# EAGLE design pid4_levitador (EAGLE 9.6.2)
Cuatro controladores PID analógicos (levitador magnético) - Brahiam Alberto Campiño Romero

## Sheet 1 of 4
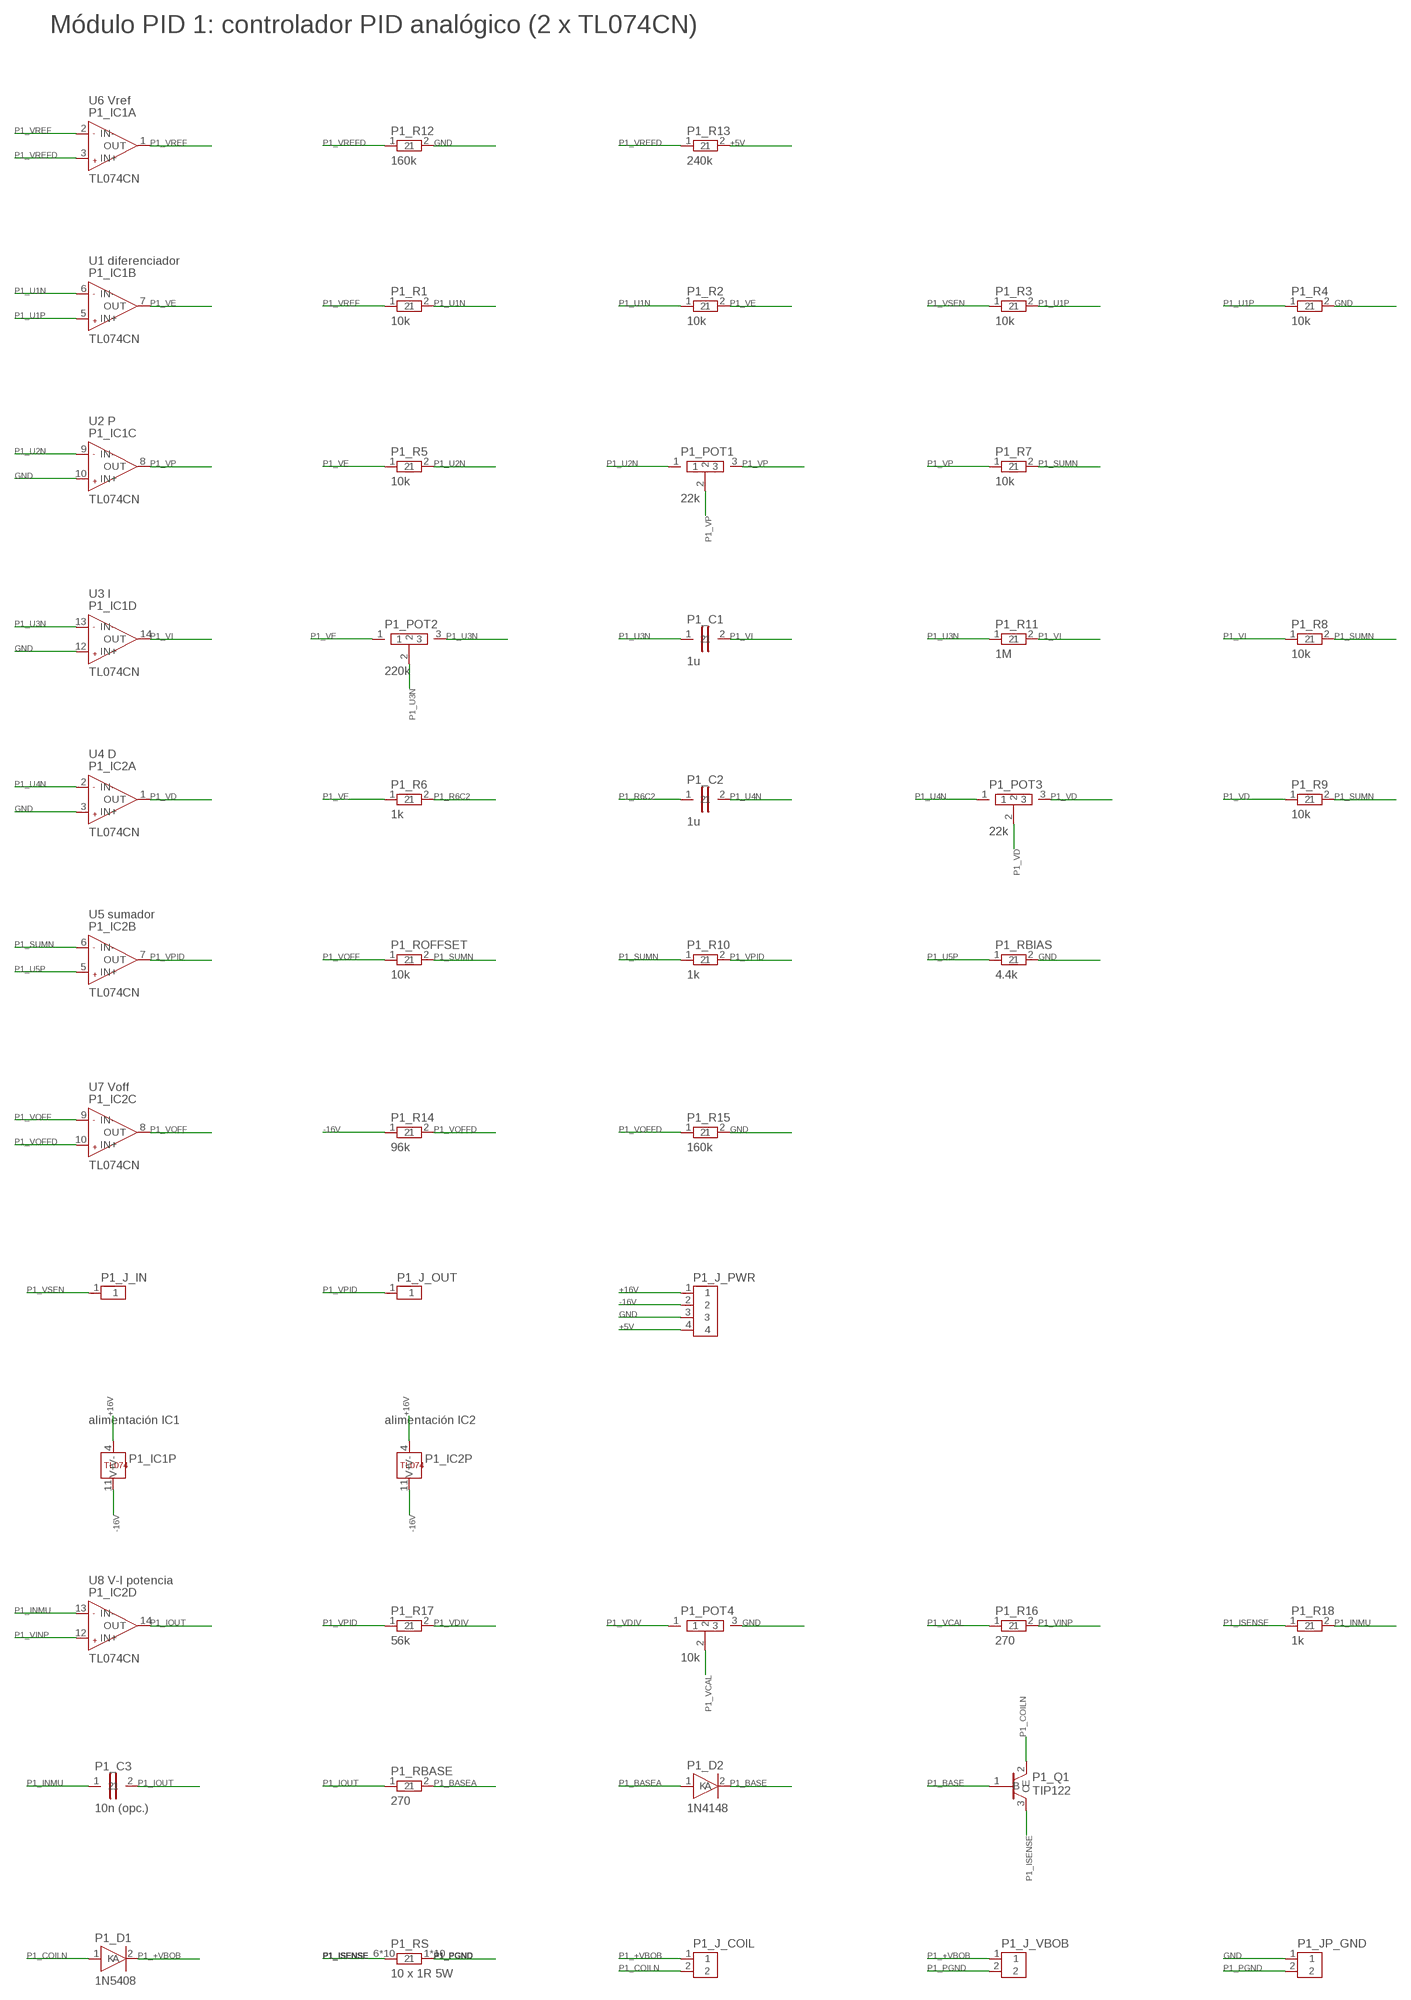
[diagram p0: schematic, sheet 1]

### Parts
P1_C1  1u  C  [CAP]
P1_C2  1u  C  [CAP]
P1_C3  10n (opc.)  C  [CAP]
P1_D1  1N5408  D1N5408  [DIODE]
P1_D2  1N4148  D1N4148  [DIODE_S]
P1_IC1  TL074CN  TL074  [DIL14]
P1_IC2  TL074CN  TL074  [DIL14]
P1_J_COIL  BOBINA  TERM2  [TERM2]
P1_J_IN  VSENSOR  HDR1  [HDR1]
P1_J_OUT  VPID  HDR1  [HDR1]
P1_J_PWR  PWR  HDR4  [HDR4]
P1_J_VBOB  VBOB  TERM2  [TERM2]
P1_JP_GND  GND-PGND  HDR2  [HDR2]
P1_POT1  22k  POT  [POT]
P1_POT2  220k  POT  [POT]
P1_POT3  22k  POT  [POT]
P1_POT4  10k  POT  [POT]
P1_Q1  TIP122  [TO220]
P1_R1  10k  R  [RES]
P1_R2  10k  R  [RES]
P1_R3  10k  R  [RES]
P1_R4  10k  R  [RES]
P1_R5  10k  R  [RES]
P1_R6  1k  R  [RES]
P1_R7  10k  R  [RES]
P1_R8  10k  R  [RES]
P1_R9  10k  R  [RES]
P1_R10  1k  R  [RES]
P1_R11  1M  R  [RES]
P1_R12  160k  R  [RES]
P1_R13  240k  R  [RES]
P1_R14  96k  R  [RES]
P1_R15  160k  R  [RES]
P1_R16  270  R  [RES]
P1_R17  56k  R  [RES]
P1_R18  1k  R  [RES]
P1_RBASE  270  R  [RES]
P1_RBIAS  4.4k  R  [RES]
P1_ROFFSET  10k  R  [RES]
P1_RS  10 x 1R 5W  RSB  [RSBANK]

### Nets
+5V: P1_J_PWR.4 P1_R13.2 ; also sheet 2,3,4
+16V: P1_IC1.4(P:V+) P1_IC2.4(P:V+) P1_J_PWR.1 ; also sheet 2,3,4
-16V: P1_IC1.11(P:V-) P1_IC2.11(P:V-) P1_J_PWR.2 P1_R14.1 ; also sheet 2,3,4
GND: P1_IC1.10(C:IN+) P1_IC1.12(D:IN+) P1_IC2.3(A:IN+) P1_J_PWR.3 P1_JP_GND.1 P1_POT4.3 P1_R4.2 P1_R12.2 P1_R15.2 P1_RBIAS.2 ; also sheet 2,3,4
P1_+VBOB: P1_D1.2(K) P1_J_COIL.1 P1_J_VBOB.1
P1_BASE: P1_D2.2(K) P1_Q1.1(B)
P1_BASEA: P1_D2.1(A) P1_RBASE.2
P1_COILN: P1_D1.1(A) P1_J_COIL.2 P1_Q1.2(C)
P1_INMU: P1_C3.1 P1_IC2.13(D:IN-) P1_R18.2
P1_IOUT: P1_C3.2 P1_IC2.14(D:OUT) P1_RBASE.1
P1_ISENSE: P1_Q1.3(E) P1_R18.1 P1_RS.6 P1_RS.7 P1_RS.8 P1_RS.9 P1_RS.10 P1_RS.11 P1_RS.12 P1_RS.13 P1_RS.14 P1_RS.15
P1_PGND: P1_J_VBOB.2 P1_JP_GND.2 P1_RS.1 P1_RS.2 P1_RS.3 P1_RS.4 P1_RS.5 P1_RS.16 P1_RS.17 P1_RS.18 P1_RS.19 P1_RS.20
P1_R6C2: P1_C2.1 P1_R6.2
P1_SUMN: P1_IC2.6(B:IN-) P1_R7.2 P1_R8.2 P1_R9.2 P1_R10.1 P1_ROFFSET.2
P1_U1N: P1_IC1.6(B:IN-) P1_R1.2 P1_R2.1
P1_U1P: P1_IC1.5(B:IN+) P1_R3.2 P1_R4.1
P1_U2N: P1_IC1.9(C:IN-) P1_POT1.1 P1_R5.2
P1_U3N: P1_C1.1 P1_IC1.13(D:IN-) P1_POT2.2 P1_POT2.3 P1_R11.1
P1_U4N: P1_C2.2 P1_IC2.2(A:IN-) P1_POT3.1
P1_U5P: P1_IC2.5(B:IN+) P1_RBIAS.1
P1_VCAL: P1_POT4.2 P1_R16.1
P1_VD: P1_IC2.1(A:OUT) P1_POT3.2 P1_POT3.3 P1_R9.1
P1_VDIV: P1_POT4.1 P1_R17.2
P1_VE: P1_IC1.7(B:OUT) P1_POT2.1 P1_R2.2 P1_R5.1 P1_R6.1
P1_VI: P1_C1.2 P1_IC1.14(D:OUT) P1_R8.1 P1_R11.2
P1_VINP: P1_IC2.12(D:IN+) P1_R16.2
P1_VOFF: P1_IC2.8(C:OUT) P1_IC2.9(C:IN-) P1_ROFFSET.1
P1_VOFFD: P1_IC2.10(C:IN+) P1_R14.2 P1_R15.1
P1_VP: P1_IC1.8(C:OUT) P1_POT1.2 P1_POT1.3 P1_R7.1
P1_VPID: P1_IC2.7(B:OUT) P1_J_OUT.1 P1_R10.2 P1_R17.1
P1_VREF: P1_IC1.1(A:OUT) P1_IC1.2(A:IN-) P1_R1.1
P1_VREFD: P1_IC1.3(A:IN+) P1_R12.1 P1_R13.1
P1_VSEN: P1_J_IN.1 P1_R3.1

### Notes on the sheet
- Módulo PID 1: controlador PID analógico (2 x TL074CN)
- U6 Vref
- U1 diferenciador
- U2 P
- U3 I
- U4 D
- U5 sumador
- U7 Voff
- alimentación IC1 | alimentación IC2
- U8 V-I potencia

## Sheet 2 of 4
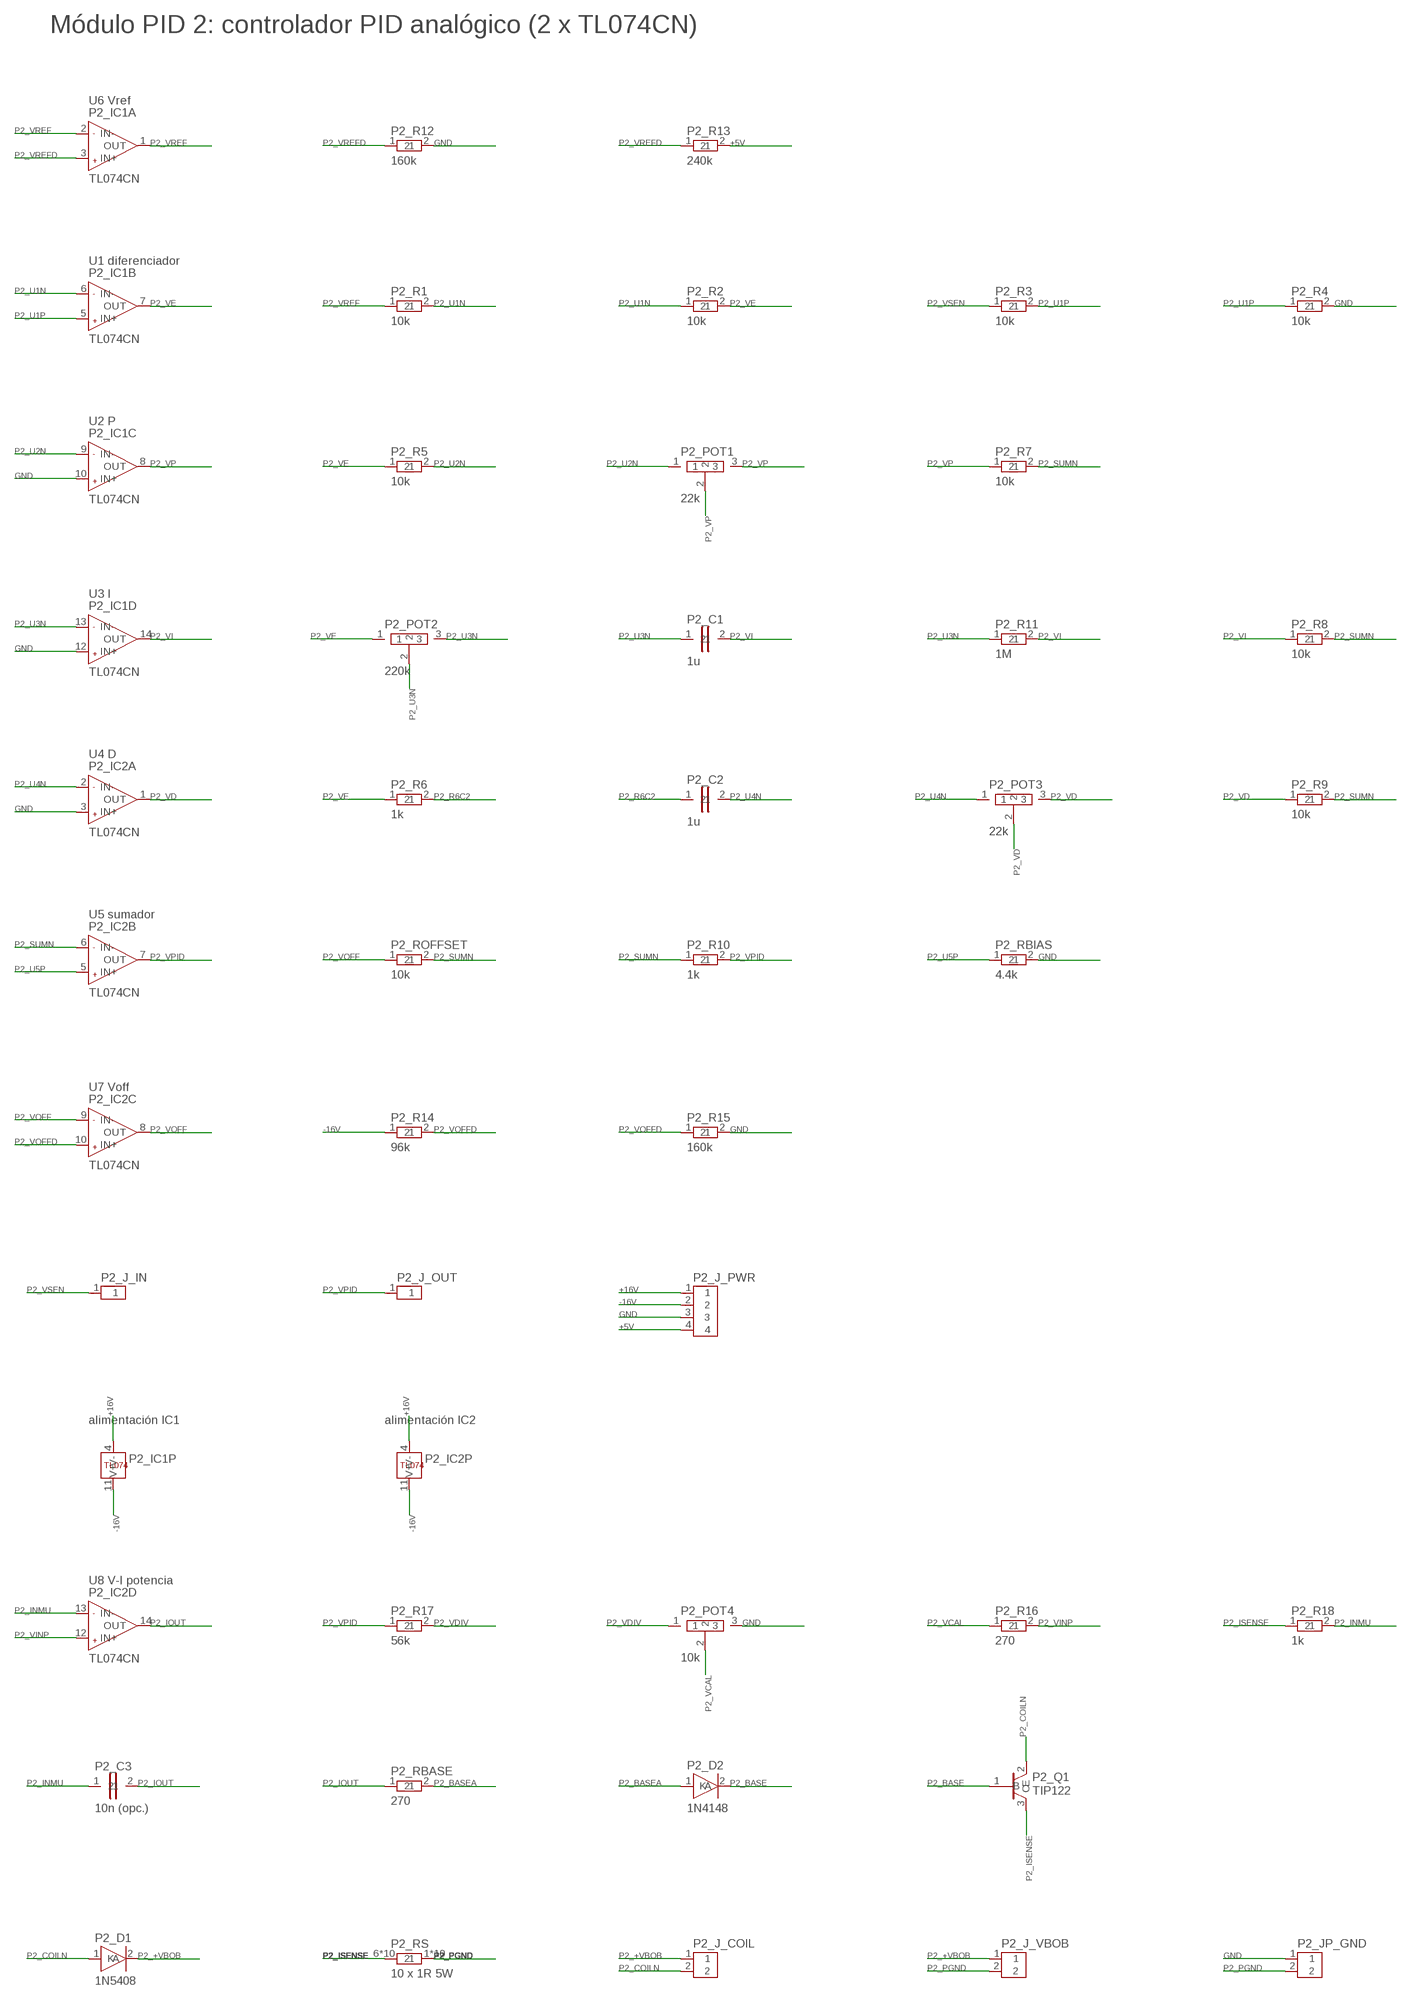
[diagram p1: schematic, sheet 2]

### Parts
P2_C1  1u  C  [CAP]
P2_C2  1u  C  [CAP]
P2_C3  10n (opc.)  C  [CAP]
P2_D1  1N5408  D1N5408  [DIODE]
P2_D2  1N4148  D1N4148  [DIODE_S]
P2_IC1  TL074CN  TL074  [DIL14]
P2_IC2  TL074CN  TL074  [DIL14]
P2_J_COIL  BOBINA  TERM2  [TERM2]
P2_J_IN  VSENSOR  HDR1  [HDR1]
P2_J_OUT  VPID  HDR1  [HDR1]
P2_J_PWR  PWR  HDR4  [HDR4]
P2_J_VBOB  VBOB  TERM2  [TERM2]
P2_JP_GND  GND-PGND  HDR2  [HDR2]
P2_POT1  22k  POT  [POT]
P2_POT2  220k  POT  [POT]
P2_POT3  22k  POT  [POT]
P2_POT4  10k  POT  [POT]
P2_Q1  TIP122  [TO220]
P2_R1  10k  R  [RES]
P2_R2  10k  R  [RES]
P2_R3  10k  R  [RES]
P2_R4  10k  R  [RES]
P2_R5  10k  R  [RES]
P2_R6  1k  R  [RES]
P2_R7  10k  R  [RES]
P2_R8  10k  R  [RES]
P2_R9  10k  R  [RES]
P2_R10  1k  R  [RES]
P2_R11  1M  R  [RES]
P2_R12  160k  R  [RES]
P2_R13  240k  R  [RES]
P2_R14  96k  R  [RES]
P2_R15  160k  R  [RES]
P2_R16  270  R  [RES]
P2_R17  56k  R  [RES]
P2_R18  1k  R  [RES]
P2_RBASE  270  R  [RES]
P2_RBIAS  4.4k  R  [RES]
P2_ROFFSET  10k  R  [RES]
P2_RS  10 x 1R 5W  RSB  [RSBANK]

### Nets
+5V: P2_J_PWR.4 P2_R13.2 ; also sheet 1,3,4
+16V: P2_IC1.4(P:V+) P2_IC2.4(P:V+) P2_J_PWR.1 ; also sheet 1,3,4
-16V: P2_IC1.11(P:V-) P2_IC2.11(P:V-) P2_J_PWR.2 P2_R14.1 ; also sheet 1,3,4
GND: P2_IC1.10(C:IN+) P2_IC1.12(D:IN+) P2_IC2.3(A:IN+) P2_J_PWR.3 P2_JP_GND.1 P2_POT4.3 P2_R4.2 P2_R12.2 P2_R15.2 P2_RBIAS.2 ; also sheet 1,3,4
P2_+VBOB: P2_D1.2(K) P2_J_COIL.1 P2_J_VBOB.1
P2_BASE: P2_D2.2(K) P2_Q1.1(B)
P2_BASEA: P2_D2.1(A) P2_RBASE.2
P2_COILN: P2_D1.1(A) P2_J_COIL.2 P2_Q1.2(C)
P2_INMU: P2_C3.1 P2_IC2.13(D:IN-) P2_R18.2
P2_IOUT: P2_C3.2 P2_IC2.14(D:OUT) P2_RBASE.1
P2_ISENSE: P2_Q1.3(E) P2_R18.1 P2_RS.6 P2_RS.7 P2_RS.8 P2_RS.9 P2_RS.10 P2_RS.11 P2_RS.12 P2_RS.13 P2_RS.14 P2_RS.15
P2_PGND: P2_J_VBOB.2 P2_JP_GND.2 P2_RS.1 P2_RS.2 P2_RS.3 P2_RS.4 P2_RS.5 P2_RS.16 P2_RS.17 P2_RS.18 P2_RS.19 P2_RS.20
P2_R6C2: P2_C2.1 P2_R6.2
P2_SUMN: P2_IC2.6(B:IN-) P2_R7.2 P2_R8.2 P2_R9.2 P2_R10.1 P2_ROFFSET.2
P2_U1N: P2_IC1.6(B:IN-) P2_R1.2 P2_R2.1
P2_U1P: P2_IC1.5(B:IN+) P2_R3.2 P2_R4.1
P2_U2N: P2_IC1.9(C:IN-) P2_POT1.1 P2_R5.2
P2_U3N: P2_C1.1 P2_IC1.13(D:IN-) P2_POT2.2 P2_POT2.3 P2_R11.1
P2_U4N: P2_C2.2 P2_IC2.2(A:IN-) P2_POT3.1
P2_U5P: P2_IC2.5(B:IN+) P2_RBIAS.1
P2_VCAL: P2_POT4.2 P2_R16.1
P2_VD: P2_IC2.1(A:OUT) P2_POT3.2 P2_POT3.3 P2_R9.1
P2_VDIV: P2_POT4.1 P2_R17.2
P2_VE: P2_IC1.7(B:OUT) P2_POT2.1 P2_R2.2 P2_R5.1 P2_R6.1
P2_VI: P2_C1.2 P2_IC1.14(D:OUT) P2_R8.1 P2_R11.2
P2_VINP: P2_IC2.12(D:IN+) P2_R16.2
P2_VOFF: P2_IC2.8(C:OUT) P2_IC2.9(C:IN-) P2_ROFFSET.1
P2_VOFFD: P2_IC2.10(C:IN+) P2_R14.2 P2_R15.1
P2_VP: P2_IC1.8(C:OUT) P2_POT1.2 P2_POT1.3 P2_R7.1
P2_VPID: P2_IC2.7(B:OUT) P2_J_OUT.1 P2_R10.2 P2_R17.1
P2_VREF: P2_IC1.1(A:OUT) P2_IC1.2(A:IN-) P2_R1.1
P2_VREFD: P2_IC1.3(A:IN+) P2_R12.1 P2_R13.1
P2_VSEN: P2_J_IN.1 P2_R3.1

### Notes on the sheet
- Módulo PID 2: controlador PID analógico (2 x TL074CN)
- U6 Vref
- U1 diferenciador
- U2 P
- U3 I
- U4 D
- U5 sumador
- U7 Voff
- alimentación IC1 | alimentación IC2
- U8 V-I potencia

## Sheet 3 of 4
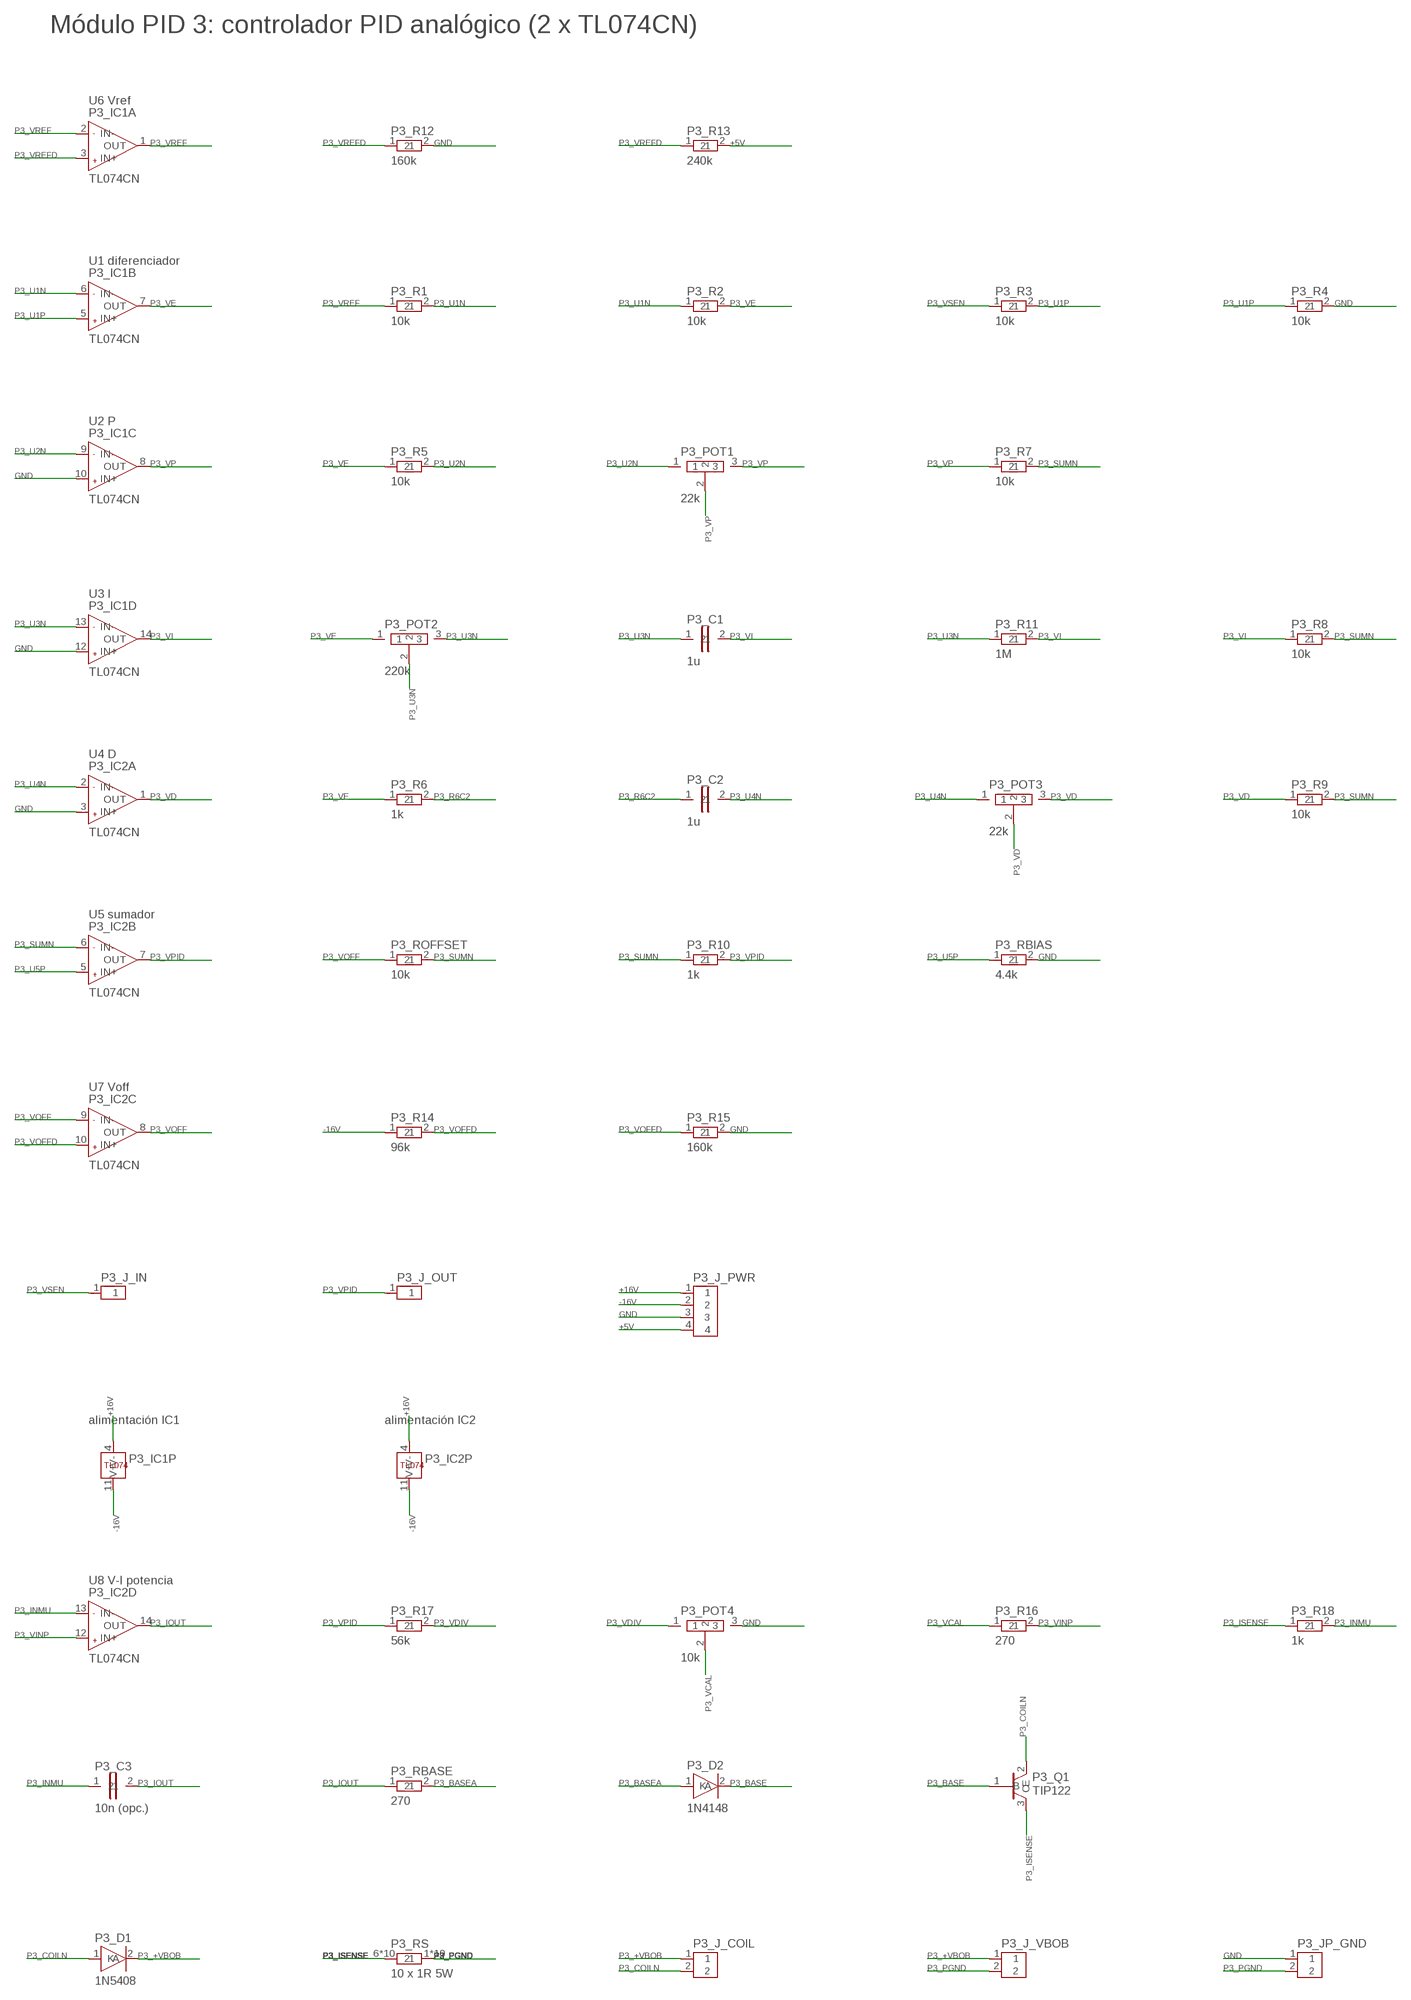
[diagram p2: schematic, sheet 3]

### Parts
P3_C1  1u  C  [CAP]
P3_C2  1u  C  [CAP]
P3_C3  10n (opc.)  C  [CAP]
P3_D1  1N5408  D1N5408  [DIODE]
P3_D2  1N4148  D1N4148  [DIODE_S]
P3_IC1  TL074CN  TL074  [DIL14]
P3_IC2  TL074CN  TL074  [DIL14]
P3_J_COIL  BOBINA  TERM2  [TERM2]
P3_J_IN  VSENSOR  HDR1  [HDR1]
P3_J_OUT  VPID  HDR1  [HDR1]
P3_J_PWR  PWR  HDR4  [HDR4]
P3_J_VBOB  VBOB  TERM2  [TERM2]
P3_JP_GND  GND-PGND  HDR2  [HDR2]
P3_POT1  22k  POT  [POT]
P3_POT2  220k  POT  [POT]
P3_POT3  22k  POT  [POT]
P3_POT4  10k  POT  [POT]
P3_Q1  TIP122  [TO220]
P3_R1  10k  R  [RES]
P3_R2  10k  R  [RES]
P3_R3  10k  R  [RES]
P3_R4  10k  R  [RES]
P3_R5  10k  R  [RES]
P3_R6  1k  R  [RES]
P3_R7  10k  R  [RES]
P3_R8  10k  R  [RES]
P3_R9  10k  R  [RES]
P3_R10  1k  R  [RES]
P3_R11  1M  R  [RES]
P3_R12  160k  R  [RES]
P3_R13  240k  R  [RES]
P3_R14  96k  R  [RES]
P3_R15  160k  R  [RES]
P3_R16  270  R  [RES]
P3_R17  56k  R  [RES]
P3_R18  1k  R  [RES]
P3_RBASE  270  R  [RES]
P3_RBIAS  4.4k  R  [RES]
P3_ROFFSET  10k  R  [RES]
P3_RS  10 x 1R 5W  RSB  [RSBANK]

### Nets
+5V: P3_J_PWR.4 P3_R13.2 ; also sheet 1,2,4
+16V: P3_IC1.4(P:V+) P3_IC2.4(P:V+) P3_J_PWR.1 ; also sheet 1,2,4
-16V: P3_IC1.11(P:V-) P3_IC2.11(P:V-) P3_J_PWR.2 P3_R14.1 ; also sheet 1,2,4
GND: P3_IC1.10(C:IN+) P3_IC1.12(D:IN+) P3_IC2.3(A:IN+) P3_J_PWR.3 P3_JP_GND.1 P3_POT4.3 P3_R4.2 P3_R12.2 P3_R15.2 P3_RBIAS.2 ; also sheet 1,2,4
P3_+VBOB: P3_D1.2(K) P3_J_COIL.1 P3_J_VBOB.1
P3_BASE: P3_D2.2(K) P3_Q1.1(B)
P3_BASEA: P3_D2.1(A) P3_RBASE.2
P3_COILN: P3_D1.1(A) P3_J_COIL.2 P3_Q1.2(C)
P3_INMU: P3_C3.1 P3_IC2.13(D:IN-) P3_R18.2
P3_IOUT: P3_C3.2 P3_IC2.14(D:OUT) P3_RBASE.1
P3_ISENSE: P3_Q1.3(E) P3_R18.1 P3_RS.6 P3_RS.7 P3_RS.8 P3_RS.9 P3_RS.10 P3_RS.11 P3_RS.12 P3_RS.13 P3_RS.14 P3_RS.15
P3_PGND: P3_J_VBOB.2 P3_JP_GND.2 P3_RS.1 P3_RS.2 P3_RS.3 P3_RS.4 P3_RS.5 P3_RS.16 P3_RS.17 P3_RS.18 P3_RS.19 P3_RS.20
P3_R6C2: P3_C2.1 P3_R6.2
P3_SUMN: P3_IC2.6(B:IN-) P3_R7.2 P3_R8.2 P3_R9.2 P3_R10.1 P3_ROFFSET.2
P3_U1N: P3_IC1.6(B:IN-) P3_R1.2 P3_R2.1
P3_U1P: P3_IC1.5(B:IN+) P3_R3.2 P3_R4.1
P3_U2N: P3_IC1.9(C:IN-) P3_POT1.1 P3_R5.2
P3_U3N: P3_C1.1 P3_IC1.13(D:IN-) P3_POT2.2 P3_POT2.3 P3_R11.1
P3_U4N: P3_C2.2 P3_IC2.2(A:IN-) P3_POT3.1
P3_U5P: P3_IC2.5(B:IN+) P3_RBIAS.1
P3_VCAL: P3_POT4.2 P3_R16.1
P3_VD: P3_IC2.1(A:OUT) P3_POT3.2 P3_POT3.3 P3_R9.1
P3_VDIV: P3_POT4.1 P3_R17.2
P3_VE: P3_IC1.7(B:OUT) P3_POT2.1 P3_R2.2 P3_R5.1 P3_R6.1
P3_VI: P3_C1.2 P3_IC1.14(D:OUT) P3_R8.1 P3_R11.2
P3_VINP: P3_IC2.12(D:IN+) P3_R16.2
P3_VOFF: P3_IC2.8(C:OUT) P3_IC2.9(C:IN-) P3_ROFFSET.1
P3_VOFFD: P3_IC2.10(C:IN+) P3_R14.2 P3_R15.1
P3_VP: P3_IC1.8(C:OUT) P3_POT1.2 P3_POT1.3 P3_R7.1
P3_VPID: P3_IC2.7(B:OUT) P3_J_OUT.1 P3_R10.2 P3_R17.1
P3_VREF: P3_IC1.1(A:OUT) P3_IC1.2(A:IN-) P3_R1.1
P3_VREFD: P3_IC1.3(A:IN+) P3_R12.1 P3_R13.1
P3_VSEN: P3_J_IN.1 P3_R3.1

### Notes on the sheet
- Módulo PID 3: controlador PID analógico (2 x TL074CN)
- U6 Vref
- U1 diferenciador
- U2 P
- U3 I
- U4 D
- U5 sumador
- U7 Voff
- alimentación IC1 | alimentación IC2
- U8 V-I potencia

## Sheet 4 of 4
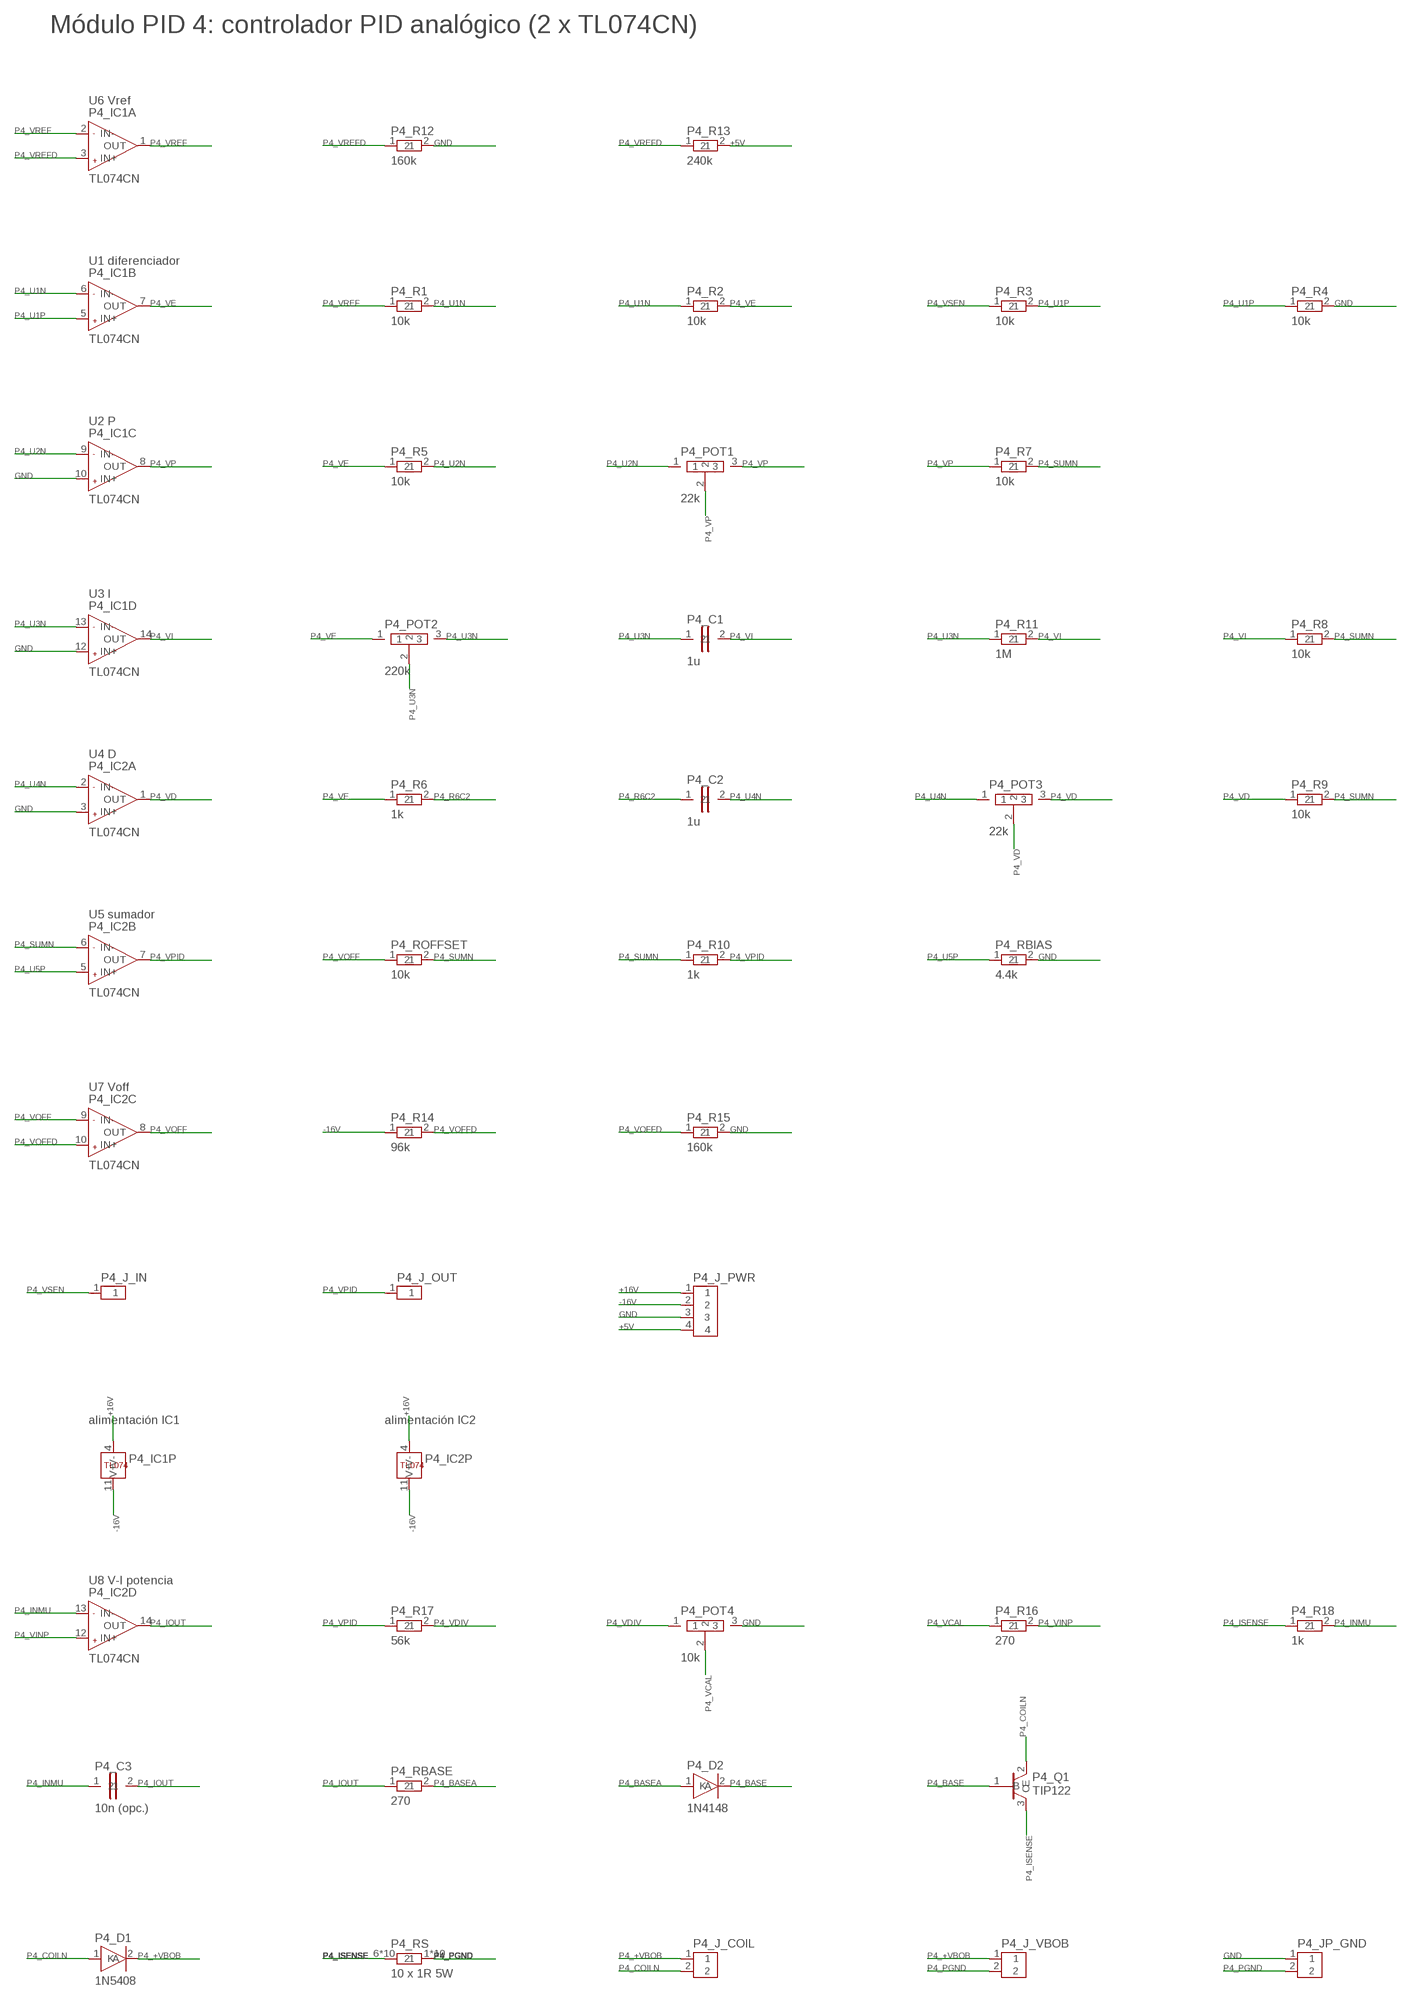
[diagram p3: schematic, sheet 4]

### Parts
P4_C1  1u  C  [CAP]
P4_C2  1u  C  [CAP]
P4_C3  10n (opc.)  C  [CAP]
P4_D1  1N5408  D1N5408  [DIODE]
P4_D2  1N4148  D1N4148  [DIODE_S]
P4_IC1  TL074CN  TL074  [DIL14]
P4_IC2  TL074CN  TL074  [DIL14]
P4_J_COIL  BOBINA  TERM2  [TERM2]
P4_J_IN  VSENSOR  HDR1  [HDR1]
P4_J_OUT  VPID  HDR1  [HDR1]
P4_J_PWR  PWR  HDR4  [HDR4]
P4_J_VBOB  VBOB  TERM2  [TERM2]
P4_JP_GND  GND-PGND  HDR2  [HDR2]
P4_POT1  22k  POT  [POT]
P4_POT2  220k  POT  [POT]
P4_POT3  22k  POT  [POT]
P4_POT4  10k  POT  [POT]
P4_Q1  TIP122  [TO220]
P4_R1  10k  R  [RES]
P4_R2  10k  R  [RES]
P4_R3  10k  R  [RES]
P4_R4  10k  R  [RES]
P4_R5  10k  R  [RES]
P4_R6  1k  R  [RES]
P4_R7  10k  R  [RES]
P4_R8  10k  R  [RES]
P4_R9  10k  R  [RES]
P4_R10  1k  R  [RES]
P4_R11  1M  R  [RES]
P4_R12  160k  R  [RES]
P4_R13  240k  R  [RES]
P4_R14  96k  R  [RES]
P4_R15  160k  R  [RES]
P4_R16  270  R  [RES]
P4_R17  56k  R  [RES]
P4_R18  1k  R  [RES]
P4_RBASE  270  R  [RES]
P4_RBIAS  4.4k  R  [RES]
P4_ROFFSET  10k  R  [RES]
P4_RS  10 x 1R 5W  RSB  [RSBANK]

### Nets
+5V: P4_J_PWR.4 P4_R13.2 ; also sheet 1,2,3
+16V: P4_IC1.4(P:V+) P4_IC2.4(P:V+) P4_J_PWR.1 ; also sheet 1,2,3
-16V: P4_IC1.11(P:V-) P4_IC2.11(P:V-) P4_J_PWR.2 P4_R14.1 ; also sheet 1,2,3
GND: P4_IC1.10(C:IN+) P4_IC1.12(D:IN+) P4_IC2.3(A:IN+) P4_J_PWR.3 P4_JP_GND.1 P4_POT4.3 P4_R4.2 P4_R12.2 P4_R15.2 P4_RBIAS.2 ; also sheet 1,2,3
P4_+VBOB: P4_D1.2(K) P4_J_COIL.1 P4_J_VBOB.1
P4_BASE: P4_D2.2(K) P4_Q1.1(B)
P4_BASEA: P4_D2.1(A) P4_RBASE.2
P4_COILN: P4_D1.1(A) P4_J_COIL.2 P4_Q1.2(C)
P4_INMU: P4_C3.1 P4_IC2.13(D:IN-) P4_R18.2
P4_IOUT: P4_C3.2 P4_IC2.14(D:OUT) P4_RBASE.1
P4_ISENSE: P4_Q1.3(E) P4_R18.1 P4_RS.6 P4_RS.7 P4_RS.8 P4_RS.9 P4_RS.10 P4_RS.11 P4_RS.12 P4_RS.13 P4_RS.14 P4_RS.15
P4_PGND: P4_J_VBOB.2 P4_JP_GND.2 P4_RS.1 P4_RS.2 P4_RS.3 P4_RS.4 P4_RS.5 P4_RS.16 P4_RS.17 P4_RS.18 P4_RS.19 P4_RS.20
P4_R6C2: P4_C2.1 P4_R6.2
P4_SUMN: P4_IC2.6(B:IN-) P4_R7.2 P4_R8.2 P4_R9.2 P4_R10.1 P4_ROFFSET.2
P4_U1N: P4_IC1.6(B:IN-) P4_R1.2 P4_R2.1
P4_U1P: P4_IC1.5(B:IN+) P4_R3.2 P4_R4.1
P4_U2N: P4_IC1.9(C:IN-) P4_POT1.1 P4_R5.2
P4_U3N: P4_C1.1 P4_IC1.13(D:IN-) P4_POT2.2 P4_POT2.3 P4_R11.1
P4_U4N: P4_C2.2 P4_IC2.2(A:IN-) P4_POT3.1
P4_U5P: P4_IC2.5(B:IN+) P4_RBIAS.1
P4_VCAL: P4_POT4.2 P4_R16.1
P4_VD: P4_IC2.1(A:OUT) P4_POT3.2 P4_POT3.3 P4_R9.1
P4_VDIV: P4_POT4.1 P4_R17.2
P4_VE: P4_IC1.7(B:OUT) P4_POT2.1 P4_R2.2 P4_R5.1 P4_R6.1
P4_VI: P4_C1.2 P4_IC1.14(D:OUT) P4_R8.1 P4_R11.2
P4_VINP: P4_IC2.12(D:IN+) P4_R16.2
P4_VOFF: P4_IC2.8(C:OUT) P4_IC2.9(C:IN-) P4_ROFFSET.1
P4_VOFFD: P4_IC2.10(C:IN+) P4_R14.2 P4_R15.1
P4_VP: P4_IC1.8(C:OUT) P4_POT1.2 P4_POT1.3 P4_R7.1
P4_VPID: P4_IC2.7(B:OUT) P4_J_OUT.1 P4_R10.2 P4_R17.1
P4_VREF: P4_IC1.1(A:OUT) P4_IC1.2(A:IN-) P4_R1.1
P4_VREFD: P4_IC1.3(A:IN+) P4_R12.1 P4_R13.1
P4_VSEN: P4_J_IN.1 P4_R3.1

### Notes on the sheet
- Módulo PID 4: controlador PID analógico (2 x TL074CN)
- U6 Vref
- U1 diferenciador
- U2 P
- U3 I
- U4 D
- U5 sumador
- U7 Voff
- alimentación IC1 | alimentación IC2
- U8 V-I potencia

## Library data of the parts
P1_C1-P1_C3 P2_C1-P2_C3 P3_C1-P3_C3 P4_C1-P4_C3 = pid4:C
P1_D1 P2_D1 P3_D1 P4_D1 = pid4:D1N5408
P1_D2 P2_D2 P3_D2 P4_D2 = pid4:D1N4148
P1_IC1 P1_IC2 P2_IC1 P2_IC2 P3_IC1 P3_IC2 P4_IC1 P4_IC2 = pid4:TL074
P1_J_COIL P1_J_VBOB P2_J_COIL P2_J_VBOB P3_J_COIL P3_J_VBOB P4_J_COIL P4_J_VBOB = pid4:TERM2
P1_J_IN P1_J_OUT P2_J_IN P2_J_OUT P3_J_IN P3_J_OUT P4_J_IN P4_J_OUT = pid4:HDR1
P1_J_PWR P2_J_PWR P3_J_PWR P4_J_PWR = pid4:HDR4
P1_JP_GND P2_JP_GND P3_JP_GND P4_JP_GND = pid4:HDR2
P1_POT1-P1_POT4 P2_POT1-P2_POT4 P3_POT1-P3_POT4 P4_POT1-P4_POT4 = pid4:POT
P1_Q1 P2_Q1 P3_Q1 P4_Q1 = pid4:TIP122
P1_R1-P1_R18 P1_RBASE P1_RBIAS P1_ROFFSET P2_R1-P2_R18 P2_RBASE P2_RBIAS P2_ROFFSET P3_R1-P3_R18 P3_RBASE P3_RBIAS P3_ROFFSET P4_R1-P4_R18 P4_RBASE P4_RBIAS P4_ROFFSET = pid4:R
P1_RS P2_RS P3_RS P4_RS = pid4:RSB

## Board
Placa de 4 controladores PID analógicos, una cara (cobre inferior) con puentes de alambre
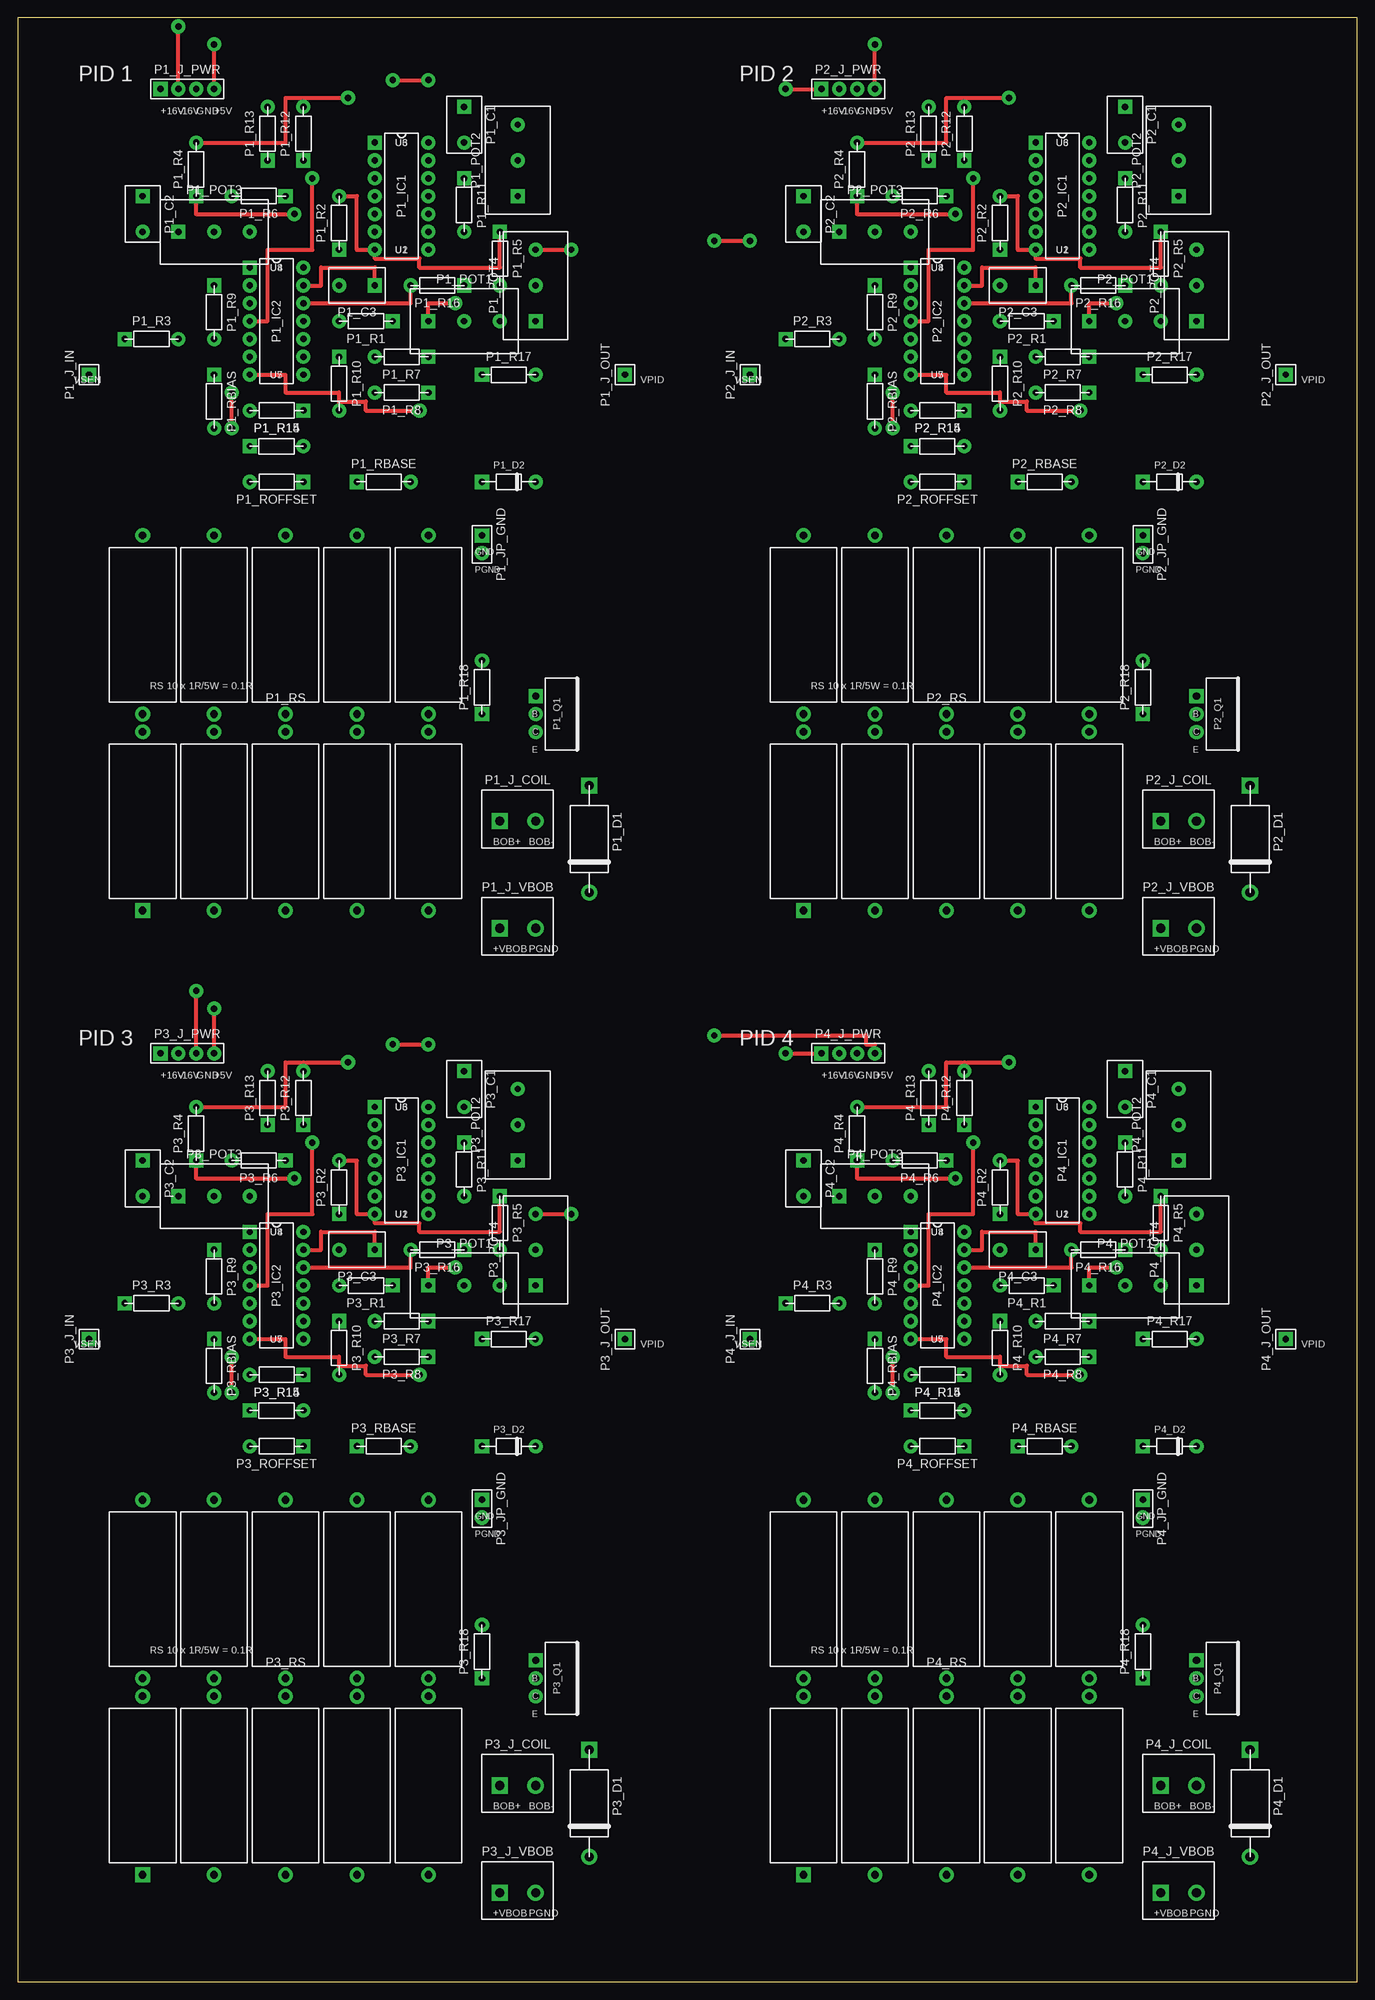
[diagram p4: board, top side]
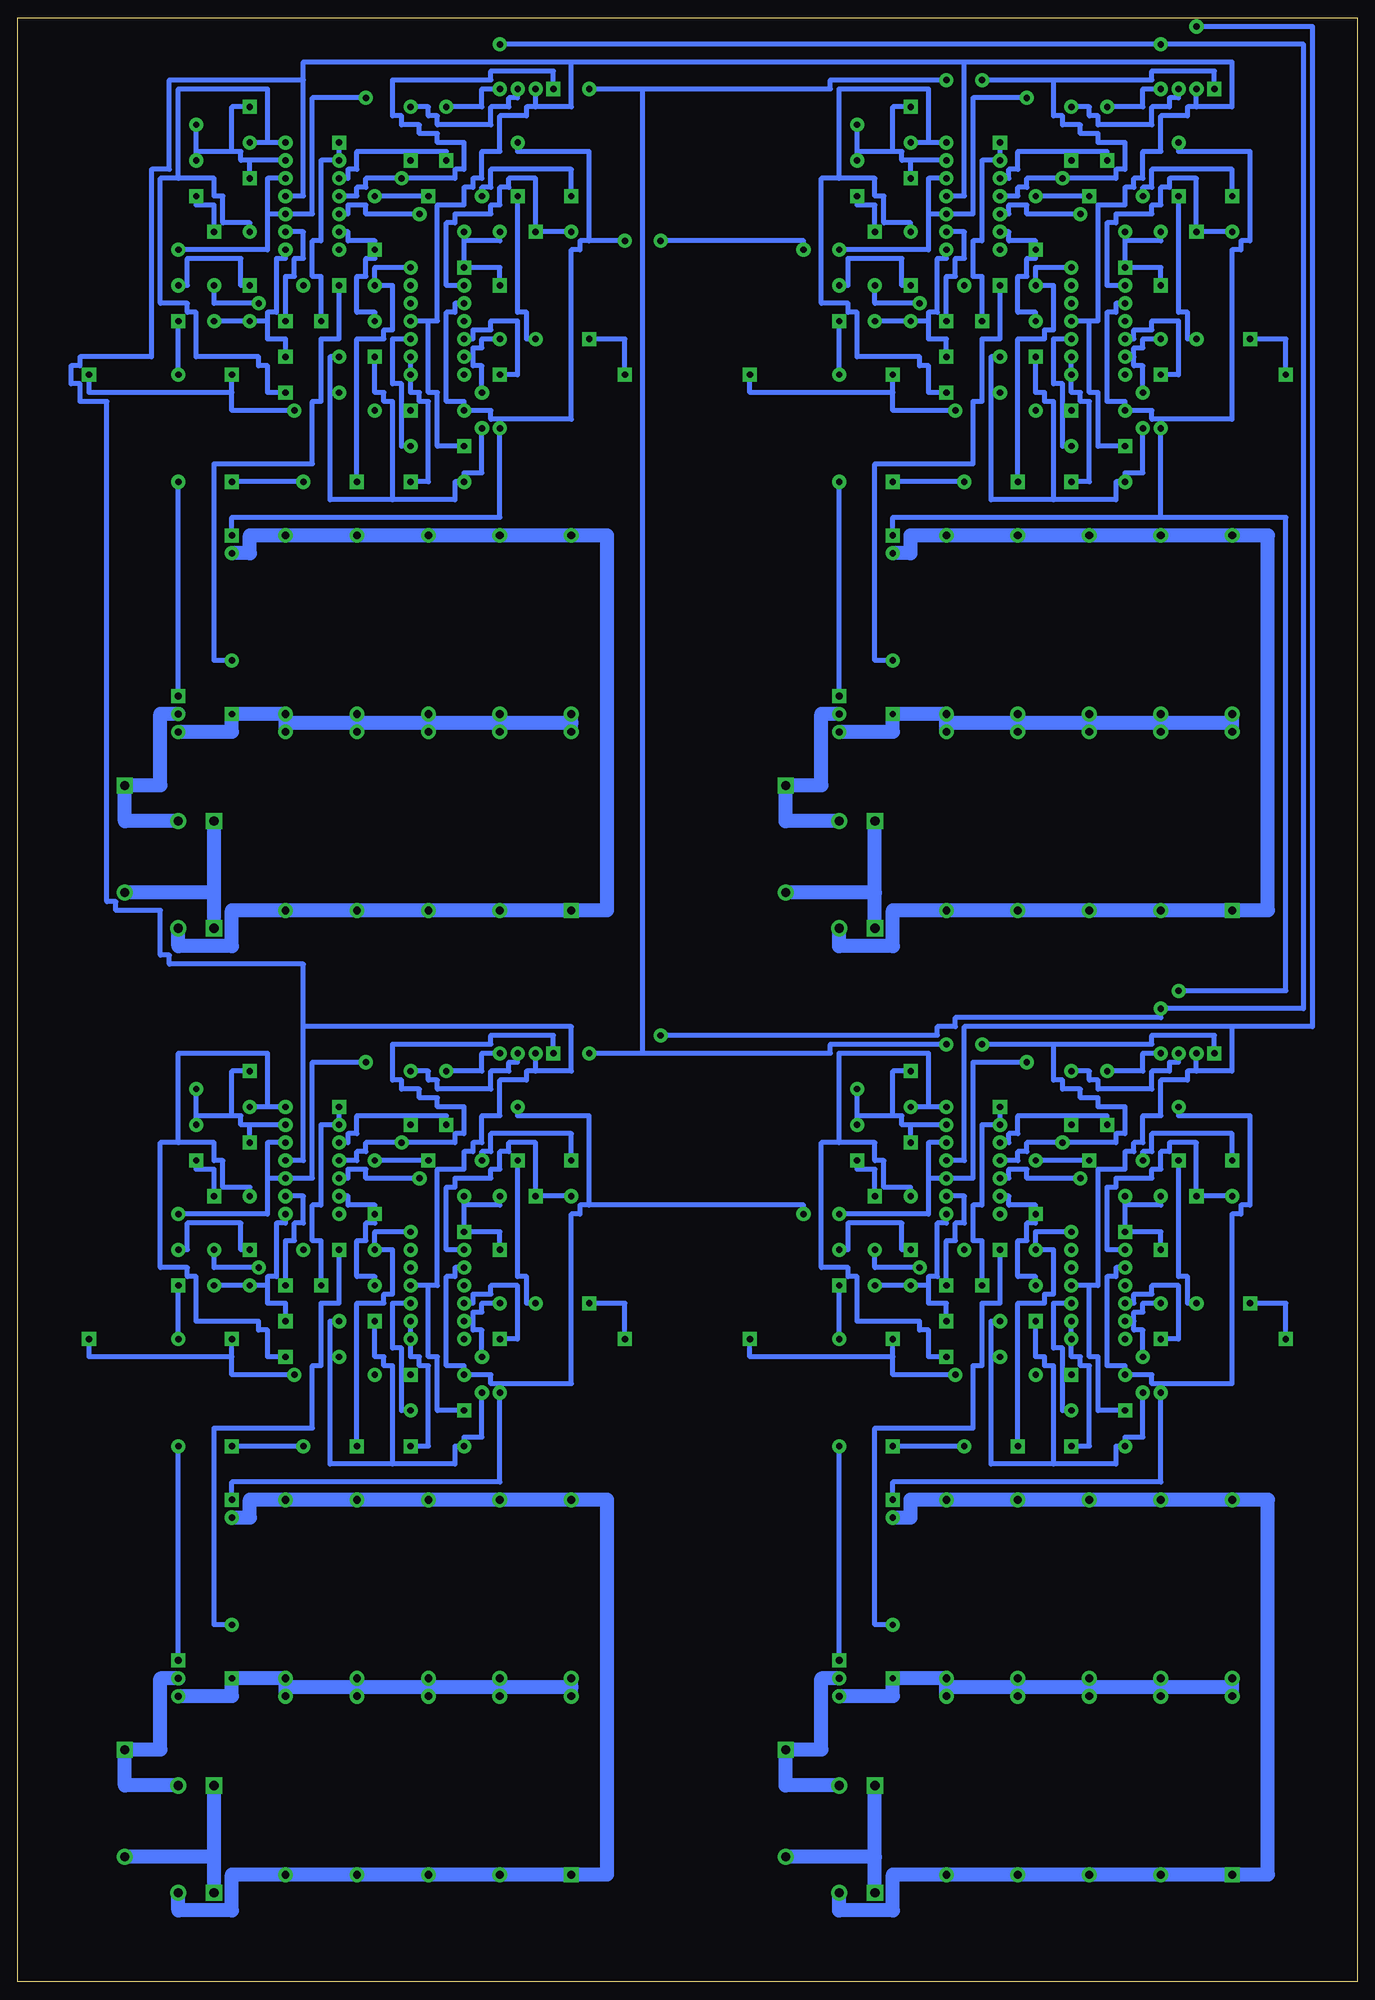
[diagram p5: board, bottom side, seen from below]

Size 190.5 x 279.4 mm. Coordinates in mm from the lower left corner, seen from the top.
Outline: 0,0 190.5,0 190.5,279.4 0,279.4 0,0
Copper layers (1*16): Top 0.035mm / dielectric 1.5mm / Bottom
Design rules "default": minimum track width 0.7mm, minimum drill 0.9mm, track to track 0.4mm, track to pad 0.4mm, pad to pad 0.4mm, via to via 0.4mm, copper to edge 0.6mm, drill to drill 0.4mm, minimum pad ring 0.5mm, minimum via ring 0.5mm

### Footprints (pad centres in the part's own frame; a part is rotated, then mirrored left to right if it is on the bottom)
CAP = drill 0.9 pad 2 square: 1 0,0 | drill 0.9 pad 2 round: 2 5.08,0
DIODE = drill 1.3 pad 2 square: 1 0,0 | drill 1.3 pad 2 round: 2 15.24,0
DIODE_S = drill 0.9 pad 2 square: 1 0,0 | drill 0.9 pad 2 round: 2 7.62,0
DIL14 = drill 0.9 pad 2 square: 1 0,0 | drill 0.9 pad 2 round: 2 0,-2.54; 3 0,-5.08; 4 0,-7.62; 5 0,-10.16; 6 0,-12.7; 7 0,-15.24; 8 7.62,-15.24; 9 7.62,-12.7; 10 7.62,-10.16; 11 7.62,-7.62; 12 7.62,-5.08; 13 7.62,-2.54; 14 7.62,0
TERM2 = drill 1.3 pad 2 square: 1 0,0 | drill 1.3 pad 2 round: 2 5.08,0
HDR1 = drill 0.9 pad 2 square: 1 0,0
HDR4 = drill 0.9 pad 2 square: 1 0,0 | drill 0.9 pad 2 round: 2 2.54,0; 3 5.08,0; 4 7.62,0
HDR2 = drill 0.9 pad 2 square: 1 0,0 | drill 0.9 pad 2 round: 2 2.54,0
POT = drill 0.9 pad 2 square: 1 0,0 | drill 0.9 pad 2 round: 2 5.08,0; 3 10.16,0
TO220 = drill 1 pad 2 square: 1 0,0 | drill 1 pad 2 round: 2 2.54,0; 3 5.08,0
RES = drill 0.9 pad 2 square: 1 0,0 | drill 0.9 pad 2 round: 2 7.62,0
RSBANK = drill 1.1 pad 2 square: 1 0,0 | drill 1.1 pad 2 round: 2 10.16,0; 3 20.32,0; 4 30.48,0; 5 40.64,0; 6 0,25.4; 7 10.16,25.4; 8 20.32,25.4; 9 30.48,25.4; 10 40.64,25.4; 11 0,27.94; 12 10.16,27.94; 13 20.32,27.94; 14 30.48,27.94; 15 40.64,27.94; 16 0,53.34; 17 10.16,53.34; 18 20.32,53.34; 19 30.48,53.34; 20 40.64,53.34

### Placement (x,y rotation side)
P1_C1  63.5,266.7 270 top
P1_C2  17.78,254 270 top
P1_C3  50.8,241.3 180 top
P1_D1  81.28,170.18 270 top
P1_D2  66.04,213.36 0 top
P1_IC1  50.8,261.62 0 top
P1_IC2  33.02,243.84 0 top
P1_J_COIL  68.58,165.1 0 top
P1_J_IN  10.16,228.6 90 top
P1_J_OUT  86.36,228.6 90 top
P1_J_PWR  20.32,269.24 0 top
P1_J_VBOB  68.58,149.86 0 top
P1_JP_GND  66.04,205.74 270 top
P1_POT1  58.42,236.22 0 top
P1_POT2  71.12,254 90 top
P1_POT3  22.86,248.92 0 top
P1_POT4  73.66,236.22 90 top
P1_Q1  73.66,182.88 270 top
P1_R1  53.34,236.22 180 top
P1_R2  45.72,246.38 90 top
P1_R3  15.24,233.68 0 top
P1_R4  25.4,254 90 top
P1_R5  68.58,248.92 270 top
P1_R6  38.1,254 180 top
P1_R7  58.42,231.14 180 top
P1_R8  58.42,226.06 180 top
P1_R9  27.94,241.3 270 top
P1_R10  45.72,231.14 270 top
P1_R11  63.5,256.54 270 top
P1_R12  40.64,259.08 90 top
P1_R13  35.56,259.08 90 top
P1_R14  33.02,218.44 0 top
P1_R15  40.64,223.52 180 top
P1_R16  63.5,241.3 180 top
P1_R17  66.04,228.6 0 top
P1_R18  66.04,180.34 90 top
P1_RBASE  48.26,213.36 0 top
P1_RBIAS  27.94,228.6 270 top
P1_ROFFSET  40.64,213.36 180 top
P1_RS  17.78,152.4 0 top
P2_C1  157.48,266.7 270 top
P2_C2  111.76,254 270 top
P2_C3  144.78,241.3 180 top
P2_D1  175.26,170.18 270 top
P2_D2  160.02,213.36 0 top
P2_IC1  144.78,261.62 0 top
P2_IC2  127,243.84 0 top
P2_J_COIL  162.56,165.1 0 top
P2_J_IN  104.14,228.6 90 top
P2_J_OUT  180.34,228.6 90 top
P2_J_PWR  114.3,269.24 0 top
P2_J_VBOB  162.56,149.86 0 top
P2_JP_GND  160.02,205.74 270 top
P2_POT1  152.4,236.22 0 top
P2_POT2  165.1,254 90 top
P2_POT3  116.84,248.92 0 top
P2_POT4  167.64,236.22 90 top
P2_Q1  167.64,182.88 270 top
P2_R1  147.32,236.22 180 top
P2_R2  139.7,246.38 90 top
P2_R3  109.22,233.68 0 top
P2_R4  119.38,254 90 top
P2_R5  162.56,248.92 270 top
P2_R6  132.08,254 180 top
P2_R7  152.4,231.14 180 top
P2_R8  152.4,226.06 180 top
P2_R9  121.92,241.3 270 top
P2_R10  139.7,231.14 270 top
P2_R11  157.48,256.54 270 top
P2_R12  134.62,259.08 90 top
P2_R13  129.54,259.08 90 top
P2_R14  127,218.44 0 top
P2_R15  134.62,223.52 180 top
P2_R16  157.48,241.3 180 top
P2_R17  160.02,228.6 0 top
P2_R18  160.02,180.34 90 top
P2_RBASE  142.24,213.36 0 top
P2_RBIAS  121.92,228.6 270 top
P2_ROFFSET  134.62,213.36 180 top
P2_RS  111.76,152.4 0 top
P3_C1  63.5,129.54 270 top
P3_C2  17.78,116.84 270 top
P3_C3  50.8,104.14 180 top
P3_D1  81.28,33.02 270 top
P3_D2  66.04,76.2 0 top
P3_IC1  50.8,124.46 0 top
P3_IC2  33.02,106.68 0 top
P3_J_COIL  68.58,27.94 0 top
P3_J_IN  10.16,91.44 90 top
P3_J_OUT  86.36,91.44 90 top
P3_J_PWR  20.32,132.08 0 top
P3_J_VBOB  68.58,12.7 0 top
P3_JP_GND  66.04,68.58 270 top
P3_POT1  58.42,99.06 0 top
P3_POT2  71.12,116.84 90 top
P3_POT3  22.86,111.76 0 top
P3_POT4  73.66,99.06 90 top
P3_Q1  73.66,45.72 270 top
P3_R1  53.34,99.06 180 top
P3_R2  45.72,109.22 90 top
P3_R3  15.24,96.52 0 top
P3_R4  25.4,116.84 90 top
P3_R5  68.58,111.76 270 top
P3_R6  38.1,116.84 180 top
P3_R7  58.42,93.98 180 top
P3_R8  58.42,88.9 180 top
P3_R9  27.94,104.14 270 top
P3_R10  45.72,93.98 270 top
P3_R11  63.5,119.38 270 top
P3_R12  40.64,121.92 90 top
P3_R13  35.56,121.92 90 top
P3_R14  33.02,81.28 0 top
P3_R15  40.64,86.36 180 top
P3_R16  63.5,104.14 180 top
P3_R17  66.04,91.44 0 top
P3_R18  66.04,43.18 90 top
P3_RBASE  48.26,76.2 0 top
P3_RBIAS  27.94,91.44 270 top
P3_ROFFSET  40.64,76.2 180 top
P3_RS  17.78,15.24 0 top
P4_C1  157.48,129.54 270 top
P4_C2  111.76,116.84 270 top
P4_C3  144.78,104.14 180 top
P4_D1  175.26,33.02 270 top
P4_D2  160.02,76.2 0 top
P4_IC1  144.78,124.46 0 top
P4_IC2  127,106.68 0 top
P4_J_COIL  162.56,27.94 0 top
P4_J_IN  104.14,91.44 90 top
P4_J_OUT  180.34,91.44 90 top
P4_J_PWR  114.3,132.08 0 top
P4_J_VBOB  162.56,12.7 0 top
P4_JP_GND  160.02,68.58 270 top
P4_POT1  152.4,99.06 0 top
P4_POT2  165.1,116.84 90 top
P4_POT3  116.84,111.76 0 top
P4_POT4  167.64,99.06 90 top
P4_Q1  167.64,45.72 270 top
P4_R1  147.32,99.06 180 top
P4_R2  139.7,109.22 90 top
P4_R3  109.22,96.52 0 top
P4_R4  119.38,116.84 90 top
P4_R5  162.56,111.76 270 top
P4_R6  132.08,116.84 180 top
P4_R7  152.4,93.98 180 top
P4_R8  152.4,88.9 180 top
P4_R9  121.92,104.14 270 top
P4_R10  139.7,93.98 270 top
P4_R11  157.48,119.38 270 top
P4_R12  134.62,121.92 90 top
P4_R13  129.54,121.92 90 top
P4_R14  127,81.28 0 top
P4_R15  134.62,86.36 180 top
P4_R16  157.48,104.14 180 top
P4_R17  160.02,91.44 0 top
P4_R18  160.02,43.18 90 top
P4_RBASE  142.24,76.2 0 top
P4_RBIAS  121.92,91.44 270 top
P4_ROFFSET  134.62,76.2 180 top
P4_RS  111.76,15.24 0 top

### Tracks (layer width: path | path; a pad name or v marks a point on that pad's centre or on a via)
+5V  (via drill 0.9 pad 2)
  Top 0.6: v99.06,134.62 120.65,134.62 120.65,133.35 121.92,133.35 P4_J_PWR.4 | P3_J_PWR.4 v27.94,138.43 | P1_J_PWR.4 v27.94,275.59 | P2_J_PWR.4 v121.92,275.59
  Bottom 0.7: P3_R13.2 30.48,129.54 30.48,132.08 P3_J_PWR.4 | P4_R13.2 124.46,129.54 124.46,132.08 P4_J_PWR.4 | v99.06,134.62 59.69,134.62 59.69,135.89 57.15,135.89 57.15,137.16 27.94,137.16 v27.94,138.43 7.62,138.43 7.62,275.59 v121.92,275.59 | P1_R13.2 30.48,266.7 30.48,269.24 P1_J_PWR.4 | P2_R13.2 124.46,266.7 124.46,269.24 P2_J_PWR.4
+16V  (via drill 0.9 pad 2)
  Top 0.6: P3_IC2.4 35.56,99.06 35.56,109.22 41.91,109.22 v41.91,119.38 | P4_IC2.4 129.54,99.06 129.54,109.22 135.89,109.22 v135.89,119.38 | v109.22,132.08 P4_J_PWR.1 | v53.34,133.35 v58.42,133.35 | P1_IC2.4 35.56,236.22 35.56,246.38 41.91,246.38 v41.91,256.54 | P2_IC2.4 129.54,236.22 129.54,246.38 135.89,246.38 v135.89,256.54 | v109.22,269.24 P2_J_PWR.1 | v53.34,270.51 v58.42,270.51
  Bottom 0.7: P3_IC1.4 48.26,116.84 48.26,118.11 46.99,118.11 46.99,119.38 34.29,119.38 34.29,120.65 33.02,120.65 33.02,124.46 36.83,124.46 36.83,125.73 39.37,125.73 39.37,127 41.91,127 41.91,128.27 43.18,128.27 43.18,133.35 | P4_IC1.4 142.24,116.84 142.24,118.11 140.97,118.11 140.97,119.38 128.27,119.38 128.27,120.65 127,120.65 127,124.46 130.81,124.46 130.81,125.73 133.35,125.73 133.35,127 135.89,127 135.89,128.27 137.16,128.27 137.16,133.35 123.19,133.35 123.19,134.62 114.3,134.62 P4_J_PWR.1 | v109.22,132.08 74.93,132.08 74.93,133.35 v58.42,133.35 | v53.34,133.35 29.21,133.35 29.21,134.62 20.32,134.62 P3_J_PWR.1 | P1_IC1.4 48.26,254 48.26,255.27 46.99,255.27 46.99,256.54 34.29,256.54 34.29,257.81 33.02,257.81 33.02,261.62 36.83,261.62 36.83,262.89 39.37,262.89 39.37,264.16 41.91,264.16 41.91,265.43 43.18,265.43 43.18,270.51 | P2_IC1.4 142.24,254 142.24,255.27 140.97,255.27 140.97,256.54 128.27,256.54 128.27,257.81 127,257.81 127,261.62 130.81,261.62 130.81,262.89 133.35,262.89 133.35,264.16 135.89,264.16 135.89,265.43 137.16,265.43 137.16,270.51 123.19,270.51 123.19,271.78 114.3,271.78 P2_J_PWR.1 | v109.22,269.24 74.93,269.24 74.93,270.51 v58.42,270.51 | v53.34,270.51 29.21,270.51 29.21,271.78 20.32,271.78 P1_J_PWR.1 | 101.6,132.08 101.6,269.24
-16V  (via drill 0.9 pad 2)
  Top 0.6: P1_J_PWR.2 v22.86,278.13
  Bottom 0.7: P3_R14.1 36.83,81.28 36.83,88.9 38.1,88.9 38.1,99.06 | P4_R14.1 130.81,81.28 130.81,88.9 132.08,88.9 132.08,99.06 | P3_IC2.11 36.83,99.06 36.83,115.57 33.02,115.57 33.02,118.11 31.75,118.11 31.75,119.38 30.48,119.38 30.48,123.19 27.94,123.19 27.94,128.27 24.13,128.27 24.13,129.54 17.78,129.54 17.78,135.89 | P4_IC2.11 130.81,99.06 130.81,115.57 127,115.57 127,118.11 125.73,118.11 125.73,119.38 124.46,119.38 124.46,123.19 121.92,123.19 121.92,128.27 118.11,128.27 118.11,129.54 111.76,129.54 111.76,135.89 149.86,135.89 | P3_IC1.11 55.88,116.84 55.88,135.89 6.35,135.89 6.35,278.13 v22.86,278.13 | P4_IC1.11 149.86,116.84 149.86,144.78 168.91,144.78 168.91,146.05 170.18,146.05 170.18,152.4 176.53,152.4 176.53,153.67 177.8,153.67 177.8,224.79 181.61,224.79 181.61,227.33 182.88,227.33 182.88,229.87 181.61,229.87 181.61,231.14 171.45,231.14 171.45,257.81 168.91,257.81 168.91,270.51 149.86,270.51 | P1_R14.1 36.83,218.44 36.83,226.06 38.1,226.06 38.1,236.22 | P2_R14.1 130.81,218.44 130.81,226.06 132.08,226.06 132.08,236.22 | P1_IC2.11 36.83,236.22 36.83,252.73 33.02,252.73 33.02,255.27 31.75,255.27 31.75,256.54 30.48,256.54 30.48,260.35 27.94,260.35 27.94,265.43 24.13,265.43 24.13,266.7 17.78,266.7 17.78,273.05 149.86,273.05 149.86,254 P2_IC1.11 | P2_IC2.11 130.81,236.22 130.81,252.73 127,252.73 127,255.27 125.73,255.27 125.73,256.54 124.46,256.54 124.46,260.35 121.92,260.35 121.92,265.43 118.11,265.43 118.11,266.7 111.76,266.7 111.76,273.05 | P1_IC1.11 55.88,254 55.88,273.05 | 22.86,129.54 P3_J_PWR.2 | 22.86,266.7 P1_J_PWR.2
  Bottom 0.7: 116.84,129.54 P4_J_PWR.2 | 116.84,266.7 P2_J_PWR.2
GND  (via drill 0.9 pad 2)
  Top 0.6: P3_POT4.3 v78.74,109.22 | P3_R4.2 38.1,124.46 38.1,130.81 v46.99,130.81 | P4_R4.2 132.08,124.46 132.08,130.81 v140.97,130.81 | P1_POT4.3 v78.74,246.38 | v99.06,247.65 v104.14,247.65 | P1_R4.2 38.1,261.62 38.1,267.97 v46.99,267.97 | P2_R4.2 132.08,261.62 132.08,267.97 v140.97,267.97 | P3_J_PWR.3 v25.4,140.97 | P3_R12.2 40.64,130.81 | P1_R12.2 40.64,267.97 | P4_R12.2 134.62,130.81 | P2_R12.2 134.62,267.97
  Bottom 0.7: P3_IC2.3 34.29,101.6 34.29,100.33 35.56,100.33 35.56,87.63 33.02,87.63 P3_R15.2 29.21,86.36 29.21,85.09 17.78,85.09 17.78,109.22 16.51,109.22 16.51,110.49 15.24,110.49 15.24,123.19 25.4,123.19 P3_R4.2 | P4_IC2.3 128.27,101.6 128.27,100.33 129.54,100.33 129.54,87.63 127,87.63 P4_R15.2 123.19,86.36 123.19,85.09 111.76,85.09 111.76,109.22 110.49,109.22 110.49,110.49 78.74,110.49 v78.74,109.22 | P3_POT4.3 60.96,109.22 60.96,119.38 P3_IC1.12 | P4_POT4.3 154.94,109.22 154.94,119.38 P4_IC1.12 | 60.96,114.3 54.61,114.3 54.61,130.81 v46.99,130.81 | 154.94,114.3 148.59,114.3 148.59,130.81 v140.97,130.81 | P3_R12.2 38.1,129.54 38.1,128.27 36.83,128.27 36.83,127 29.21,127 29.21,129.54 26.67,129.54 26.67,130.81 25.4,130.81 P3_J_PWR.3 | P4_R12.2 132.08,129.54 132.08,128.27 130.81,128.27 130.81,127 123.19,127 123.19,129.54 120.65,129.54 120.65,130.81 119.38,130.81 P4_J_PWR.3 | v25.4,140.97 10.16,140.97 10.16,208.28 66.04,208.28 P1_JP_GND.1 | P1_IC2.3 34.29,238.76 34.29,237.49 35.56,237.49 35.56,224.79 33.02,224.79 P1_R15.2 29.21,223.52 29.21,222.25 17.78,222.25 17.78,246.38 16.51,246.38 16.51,247.65 15.24,247.65 15.24,260.35 25.4,260.35 P1_R4.2 | P2_IC2.3 128.27,238.76 128.27,237.49 129.54,237.49 129.54,224.79 127,224.79 P2_R15.2 123.19,223.52 123.19,222.25 111.76,222.25 111.76,246.38 110.49,246.38 110.49,247.65 v104.14,247.65 | P1_POT4.3 60.96,246.38 60.96,256.54 P1_IC1.12 | P2_POT4.3 154.94,246.38 154.94,256.54 P2_IC1.12 | v99.06,247.65 78.74,247.65 v78.74,246.38 | 60.96,251.46 54.61,251.46 54.61,267.97 v46.99,267.97 | 154.94,251.46 148.59,251.46 148.59,267.97 v140.97,267.97
  Bottom 0.7: P1_R12.2 38.1,266.7 38.1,265.43 36.83,265.43 36.83,264.16 29.21,264.16 29.21,266.7 26.67,266.7 26.67,267.97 25.4,267.97 P1_J_PWR.3 | P2_R12.2 132.08,266.7 132.08,265.43 130.81,265.43 130.81,264.16 123.19,264.16 123.19,266.7 120.65,266.7 120.65,267.97 119.38,267.97 P2_J_PWR.3 | 27.94,85.09 27.94,71.12 66.04,71.12 P3_JP_GND.1 | 27.94,208.28 27.94,222.25 | 109.22,110.49 109.22,123.19 119.38,123.19 P4_R4.2 | 109.22,247.65 109.22,260.35 119.38,260.35 P2_R4.2 | 121.92,85.09 121.92,71.12 160.02,71.12 P4_JP_GND.1 | 121.92,222.25 121.92,208.28 160.02,208.28 P2_JP_GND.1
P1_+VBOB
  Bottom 2: 68.58,154.94 P1_D1.2 | P1_J_VBOB.1 P1_J_COIL.1
P1_BASE
  Bottom 0.7: P1_Q1.1 P1_D2.2
P1_BASEA
  Bottom 0.7: P1_RBASE.2 P1_D2.1
P1_COILN
  Bottom 2: P1_J_COIL.2 81.28,165.1 P1_D1.1 76.2,170.18 76.2,180.34 P1_Q1.2
P1_INMU
  Top 0.6: P1_IC2.13 43.18,241.3 43.18,243.84 50.8,243.84 P1_C3.1
  Bottom 0.7: P1_R18.2 68.58,187.96 68.58,215.9 54.61,215.9 54.61,224.79 53.34,224.79 53.34,233.68 50.8,233.68 P1_C3.1
P1_IOUT
  Bottom 0.7: P1_IC2.14 45.72,243.84 P1_C3.2 43.18,241.3 43.18,234.95 44.45,234.95 44.45,233.68 48.26,233.68 P1_RBASE.1
P1_ISENSE
  Bottom 2: P1_Q1.3 66.04,177.8 P1_R18.1 P1_RS.15 P1_RS.10 | 17.78,179.07 58.42,179.07 | P1_RS.6 P1_RS.11 | P1_RS.7 P1_RS.12 | P1_RS.8 P1_RS.13 | P1_RS.9 P1_RS.14
P1_PGND
  Bottom 2: P1_JP_GND.2 63.5,203.2 63.5,205.74 12.7,205.74 12.7,152.4 66.04,152.4 66.04,147.32 73.66,147.32 P1_J_VBOB.2
P1_R6C2
  Bottom 0.7: P1_C2.1 17.78,257.81 29.21,257.81 29.21,255.27 30.48,255.27 P1_R6.2
P1_SUMN  (via drill 0.9 pad 2)
  Top 0.6: v30.48,220.98 v30.48,226.06
  Bottom 0.7: P1_R8.2 52.07,226.06 | 31.75,231.14 P1_IC2.6 | P1_R7.2 52.07,231.14 52.07,210.82 34.29,210.82 34.29,213.36 P1_ROFFSET.2 33.02,214.63 30.48,214.63 v30.48,220.98 | P1_R9.2 30.48,233.68 30.48,232.41 31.75,232.41 31.75,229.87 30.48,229.87 v30.48,226.06 | 43.18,210.82 43.18,224.79 44.45,224.79 44.45,226.06 45.72,226.06 P1_R10.1
P1_U1N
  Bottom 0.7: P1_IC1.6 49.53,248.92 49.53,247.65 45.72,247.65 45.72,245.11 46.99,245.11 46.99,242.57 48.26,242.57 48.26,237.49 45.72,237.49 P1_R1.2
P1_U1P  (via drill 0.9 pad 2)
  Top 0.6: v39.37,251.46 25.4,251.46 P1_R4.1
  Bottom 0.7: P1_R3.2 24.13,233.68 24.13,237.49 25.4,237.49 P1_R4.1 | v39.37,251.46 46.99,251.46 46.99,252.73 49.53,252.73 49.53,251.46 P1_IC1.5
P1_U2N  (via drill 0.9 pad 2)
  Top 0.6: v62.23,238.76 58.42,238.76 P1_POT1.1
  Bottom 0.7: v62.23,238.76 68.58,238.76 P1_R5.2 | P1_IC1.9 55.88,248.92 55.88,245.11 57.15,245.11 57.15,242.57 58.42,242.57 P1_POT1.1
P1_U3N
  Bottom 0.7: P1_IC1.13 64.77,259.08 64.77,260.35 71.12,260.35 | P1_C1.1 66.04,266.7 66.04,260.35 | P1_R11.1 63.5,259.08 | P1_POT2.2 P1_POT2.3
P1_U4N
  Bottom 0.7: P1_IC2.2 35.56,241.3 35.56,250.19 34.29,250.19 34.29,251.46 29.21,251.46 29.21,252.73 27.94,252.73 27.94,255.27 26.67,255.27 26.67,256.54 22.86,256.54 P1_POT3.1 P1_C2.2
P1_U5P
  Bottom 0.7: P1_RBIAS.1 25.4,228.6 25.4,236.22 29.21,236.22 29.21,234.95 31.75,234.95 31.75,233.68 P1_IC2.5
P1_VCAL
  Bottom 0.7: P1_R16.1 64.77,241.3 64.77,245.11 72.39,245.11 72.39,241.3 P1_POT4.2
P1_VD
  Bottom 0.7: 33.02,247.65 27.94,247.65 P1_POT3.2 | P1_R9.1 27.94,243.84 P1_IC2.1 P1_POT3.3
P1_VDIV
  Bottom 0.7: P1_R17.2 P1_POT4.1
P1_VE
  Top 0.6: P1_R2.2 48.26,254 48.26,246.38 P1_IC1.7 50.8,245.11 57.15,245.11 57.15,243.84 68.58,243.84 P1_R5.1
  Bottom 0.7: P1_R6.1 P1_R2.2 | P1_R5.1 68.58,252.73 71.12,252.73 P1_POT2.1
P1_VI
  Bottom 0.7: P1_R8.1 60.96,226.06 60.96,229.87 62.23,229.87 62.23,231.14 71.12,231.14 71.12,237.49 72.39,237.49 72.39,238.76 76.2,238.76 76.2,256.54 68.58,256.54 68.58,254 67.31,254 67.31,250.19 63.5,250.19 P1_R11.2 | P1_IC1.14 P1_C1.2 | 60.96,261.62 60.96,269.24 73.66,269.24 73.66,256.54
P1_VINP
  Top 0.6: P1_IC2.12 55.88,238.76 P1_R16.2
P1_VOFF
  Bottom 0.7: P1_ROFFSET.1 38.1,213.36 38.1,224.79 39.37,224.79 39.37,226.06 40.64,226.06 P1_IC2.9
P1_VOFFD
  Bottom 0.7: P1_R14.2 41.91,218.44 41.91,227.33 43.18,227.33 43.18,233.68 P1_IC2.10 | P1_R15.1 41.91,223.52
P1_VP
  Bottom 0.7: 60.96,236.22 P1_POT1.3 | P1_R7.1 58.42,233.68 60.96,233.68 60.96,237.49 59.69,237.49 59.69,245.11 58.42,245.11 P1_IC1.8
P1_VPID  (via drill 0.9 pad 2)
  Top 0.6: v57.15,223.52 49.53,223.52 49.53,224.79 45.72,224.79 | P1_IC2.7 38.1,228.6 38.1,226.06 45.72,226.06 P1_R10.2
  Bottom 0.7: v57.15,223.52 66.04,223.52 P1_R17.1 | 66.04,226.06 86.36,226.06 P1_J_OUT.1
P1_VREF
  Bottom 0.7: P1_IC1.1 P1_IC1.2 53.34,259.08 53.34,247.65 54.61,247.65 54.61,242.57 53.34,242.57 P1_R1.1
P1_VREFD
  Bottom 0.7: P1_IC1.3 49.53,256.54 49.53,257.81 48.26,257.81 48.26,260.35 35.56,260.35 P1_R13.1 | P1_R12.1 40.64,260.35
P1_VSEN
  Bottom 0.7: P1_R3.1 10.16,233.68 P1_J_IN.1
P2_+VBOB
  Bottom 2: 162.56,154.94 P2_D1.2 | P2_J_VBOB.1 P2_J_COIL.1
P2_BASE
  Bottom 0.7: P2_Q1.1 P2_D2.2
P2_BASEA
  Bottom 0.7: P2_RBASE.2 P2_D2.1
P2_COILN
  Bottom 2: P2_J_COIL.2 175.26,165.1 P2_D1.1 170.18,170.18 170.18,180.34 P2_Q1.2
P2_INMU
  Top 0.6: P2_IC2.13 137.16,241.3 137.16,243.84 144.78,243.84 P2_C3.1
  Bottom 0.7: P2_R18.2 162.56,187.96 162.56,215.9 148.59,215.9 148.59,224.79 147.32,224.79 147.32,233.68 144.78,233.68 P2_C3.1
P2_IOUT
  Bottom 0.7: P2_IC2.14 139.7,243.84 P2_C3.2 137.16,241.3 137.16,234.95 138.43,234.95 138.43,233.68 142.24,233.68 P2_RBASE.1
P2_ISENSE
  Bottom 2: P2_Q1.3 160.02,177.8 P2_R18.1 P2_RS.15 P2_RS.10 | 111.76,179.07 152.4,179.07 | P2_RS.6 P2_RS.11 | P2_RS.7 P2_RS.12 | P2_RS.8 P2_RS.13 | P2_RS.9 P2_RS.14
P2_PGND
  Bottom 2: P2_JP_GND.2 157.48,203.2 157.48,205.74 106.68,205.74 106.68,152.4 160.02,152.4 160.02,147.32 167.64,147.32 P2_J_VBOB.2
P2_R6C2
  Bottom 0.7: P2_C2.1 111.76,257.81 123.19,257.81 123.19,255.27 124.46,255.27 P2_R6.2
P2_SUMN  (via drill 0.9 pad 2)
  Top 0.6: v124.46,220.98 v124.46,226.06
  Bottom 0.7: P2_R8.2 146.05,226.06 | 125.73,231.14 P2_IC2.6 | P2_R7.2 146.05,231.14 146.05,210.82 128.27,210.82 128.27,213.36 P2_ROFFSET.2 127,214.63 124.46,214.63 v124.46,220.98 | P2_R9.2 124.46,233.68 124.46,232.41 125.73,232.41 125.73,229.87 124.46,229.87 v124.46,226.06 | 137.16,210.82 137.16,224.79 138.43,224.79 138.43,226.06 139.7,226.06 P2_R10.1
P2_U1N
  Bottom 0.7: P2_IC1.6 143.51,248.92 143.51,247.65 139.7,247.65 139.7,245.11 140.97,245.11 140.97,242.57 142.24,242.57 142.24,237.49 139.7,237.49 P2_R1.2
P2_U1P  (via drill 0.9 pad 2)
  Top 0.6: v133.35,251.46 119.38,251.46 P2_R4.1
  Bottom 0.7: P2_R3.2 118.11,233.68 118.11,237.49 119.38,237.49 P2_R4.1 | v133.35,251.46 140.97,251.46 140.97,252.73 143.51,252.73 143.51,251.46 P2_IC1.5
P2_U2N  (via drill 0.9 pad 2)
  Top 0.6: v156.21,238.76 152.4,238.76 P2_POT1.1
  Bottom 0.7: v156.21,238.76 162.56,238.76 P2_R5.2 | P2_IC1.9 149.86,248.92 149.86,245.11 151.13,245.11 151.13,242.57 152.4,242.57 P2_POT1.1
P2_U3N
  Bottom 0.7: P2_IC1.13 158.75,259.08 158.75,260.35 165.1,260.35 | P2_C1.1 160.02,266.7 160.02,260.35 | P2_R11.1 157.48,259.08 | P2_POT2.2 P2_POT2.3
P2_U4N
  Bottom 0.7: P2_IC2.2 129.54,241.3 129.54,250.19 128.27,250.19 128.27,251.46 123.19,251.46 123.19,252.73 121.92,252.73 121.92,255.27 120.65,255.27 120.65,256.54 116.84,256.54 P2_POT3.1 P2_C2.2
P2_U5P
  Bottom 0.7: P2_RBIAS.1 119.38,228.6 119.38,236.22 123.19,236.22 123.19,234.95 125.73,234.95 125.73,233.68 P2_IC2.5
P2_VCAL
  Bottom 0.7: P2_R16.1 158.75,241.3 158.75,245.11 166.37,245.11 166.37,241.3 P2_POT4.2
P2_VD
  Bottom 0.7: 127,247.65 121.92,247.65 P2_POT3.2 | P2_R9.1 121.92,243.84 P2_IC2.1 P2_POT3.3
P2_VDIV
  Bottom 0.7: P2_R17.2 P2_POT4.1
P2_VE
  Top 0.6: P2_R2.2 142.24,254 142.24,246.38 P2_IC1.7 144.78,245.11 151.13,245.11 151.13,243.84 162.56,243.84 P2_R5.1
  Bottom 0.7: P2_R6.1 P2_R2.2 | P2_R5.1 162.56,252.73 165.1,252.73 P2_POT2.1
P2_VI
  Bottom 0.7: P2_R8.1 154.94,226.06 154.94,229.87 156.21,229.87 156.21,231.14 165.1,231.14 165.1,237.49 166.37,237.49 166.37,238.76 170.18,238.76 170.18,256.54 162.56,256.54 162.56,254 161.29,254 161.29,250.19 157.48,250.19 P2_R11.2 | P2_IC1.14 P2_C1.2 | 154.94,261.62 154.94,269.24 167.64,269.24 167.64,256.54
P2_VINP
  Top 0.6: P2_IC2.12 149.86,238.76 P2_R16.2
P2_VOFF
  Bottom 0.7: P2_ROFFSET.1 132.08,213.36 132.08,224.79 133.35,224.79 133.35,226.06 134.62,226.06 P2_IC2.9
P2_VOFFD
  Bottom 0.7: P2_R14.2 135.89,218.44 135.89,227.33 137.16,227.33 137.16,233.68 P2_IC2.10 | P2_R15.1 135.89,223.52
P2_VP
  Bottom 0.7: 154.94,236.22 P2_POT1.3 | P2_R7.1 152.4,233.68 154.94,233.68 154.94,237.49 153.67,237.49 153.67,245.11 152.4,245.11 P2_IC1.8
P2_VPID  (via drill 0.9 pad 2)
  Top 0.6: v151.13,223.52 143.51,223.52 143.51,224.79 139.7,224.79 | P2_IC2.7 132.08,228.6 132.08,226.06 139.7,226.06 P2_R10.2
  Bottom 0.7: v151.13,223.52 160.02,223.52 P2_R17.1 | 160.02,226.06 180.34,226.06 P2_J_OUT.1
P2_VREF
  Bottom 0.7: P2_IC1.1 P2_IC1.2 147.32,259.08 147.32,247.65 148.59,247.65 148.59,242.57 147.32,242.57 P2_R1.1
P2_VREFD
  Bottom 0.7: P2_IC1.3 143.51,256.54 143.51,257.81 142.24,257.81 142.24,260.35 129.54,260.35 P2_R13.1 | P2_R12.1 134.62,260.35
P2_VSEN
  Bottom 0.7: P2_R3.1 104.14,233.68 P2_J_IN.1
P3_+VBOB
  Bottom 2: 68.58,17.78 P3_D1.2 | P3_J_VBOB.1 P3_J_COIL.1
P3_BASE
  Bottom 0.7: P3_Q1.1 P3_D2.2
P3_BASEA
  Bottom 0.7: P3_RBASE.2 P3_D2.1
P3_COILN
  Bottom 2: P3_J_COIL.2 81.28,27.94 P3_D1.1 76.2,33.02 76.2,43.18 P3_Q1.2
P3_INMU
  Top 0.6: P3_IC2.13 43.18,104.14 43.18,106.68 50.8,106.68 P3_C3.1
  Bottom 0.7: P3_R18.2 68.58,50.8 68.58,78.74 54.61,78.74 54.61,87.63 53.34,87.63 53.34,96.52 50.8,96.52 P3_C3.1
P3_IOUT
  Bottom 0.7: P3_IC2.14 45.72,106.68 P3_C3.2 43.18,104.14 43.18,97.79 44.45,97.79 44.45,96.52 48.26,96.52 P3_RBASE.1
P3_ISENSE
  Bottom 2: P3_Q1.3 66.04,40.64 P3_R18.1 P3_RS.15 P3_RS.10 | 17.78,41.91 58.42,41.91 | P3_RS.6 P3_RS.11 | P3_RS.7 P3_RS.12 | P3_RS.8 P3_RS.13 | P3_RS.9 P3_RS.14
P3_PGND
  Bottom 2: P3_JP_GND.2 63.5,66.04 63.5,68.58 12.7,68.58 12.7,15.24 66.04,15.24 66.04,10.16 73.66,10.16 P3_J_VBOB.2
P3_R6C2
  Bottom 0.7: P3_C2.1 17.78,120.65 29.21,120.65 29.21,118.11 30.48,118.11 P3_R6.2
P3_SUMN  (via drill 0.9 pad 2)
  Top 0.6: v30.48,83.82 v30.48,88.9
  Bottom 0.7: P3_R8.2 52.07,88.9 | 31.75,93.98 P3_IC2.6 | P3_R7.2 52.07,93.98 52.07,73.66 34.29,73.66 34.29,76.2 P3_ROFFSET.2 33.02,77.47 30.48,77.47 v30.48,83.82 | P3_R9.2 30.48,96.52 30.48,95.25 31.75,95.25 31.75,92.71 30.48,92.71 v30.48,88.9 | 43.18,73.66 43.18,87.63 44.45,87.63 44.45,88.9 45.72,88.9 P3_R10.1
P3_U1N
  Bottom 0.7: P3_IC1.6 49.53,111.76 49.53,110.49 45.72,110.49 45.72,107.95 46.99,107.95 46.99,105.41 48.26,105.41 48.26,100.33 45.72,100.33 P3_R1.2
P3_U1P  (via drill 0.9 pad 2)
  Top 0.6: v39.37,114.3 25.4,114.3 P3_R4.1
  Bottom 0.7: P3_R3.2 24.13,96.52 24.13,100.33 25.4,100.33 P3_R4.1 | v39.37,114.3 46.99,114.3 46.99,115.57 49.53,115.57 49.53,114.3 P3_IC1.5
P3_U2N  (via drill 0.9 pad 2)
  Top 0.6: v62.23,101.6 58.42,101.6 P3_POT1.1
  Bottom 0.7: v62.23,101.6 68.58,101.6 P3_R5.2 | P3_IC1.9 55.88,111.76 55.88,107.95 57.15,107.95 57.15,105.41 58.42,105.41 P3_POT1.1
P3_U3N
  Bottom 0.7: P3_IC1.13 64.77,121.92 64.77,123.19 71.12,123.19 | P3_C1.1 66.04,129.54 66.04,123.19 | P3_R11.1 63.5,121.92 | P3_POT2.2 P3_POT2.3
P3_U4N
  Bottom 0.7: P3_IC2.2 35.56,104.14 35.56,113.03 34.29,113.03 34.29,114.3 29.21,114.3 29.21,115.57 27.94,115.57 27.94,118.11 26.67,118.11 26.67,119.38 22.86,119.38 P3_POT3.1 P3_C2.2
P3_U5P
  Bottom 0.7: P3_RBIAS.1 25.4,91.44 25.4,99.06 29.21,99.06 29.21,97.79 31.75,97.79 31.75,96.52 P3_IC2.5
P3_VCAL
  Bottom 0.7: P3_R16.1 64.77,104.14 64.77,107.95 72.39,107.95 72.39,104.14 P3_POT4.2
P3_VD
  Bottom 0.7: 33.02,110.49 27.94,110.49 P3_POT3.2 | P3_R9.1 27.94,106.68 P3_IC2.1 P3_POT3.3
P3_VDIV
  Bottom 0.7: P3_R17.2 P3_POT4.1
P3_VE
  Top 0.6: P3_R2.2 48.26,116.84 48.26,109.22 P3_IC1.7 50.8,107.95 57.15,107.95 57.15,106.68 68.58,106.68 P3_R5.1
  Bottom 0.7: P3_R6.1 P3_R2.2 | P3_R5.1 68.58,115.57 71.12,115.57 P3_POT2.1
P3_VI
  Bottom 0.7: P3_R8.1 60.96,88.9 60.96,92.71 62.23,92.71 62.23,93.98 71.12,93.98 71.12,100.33 72.39,100.33 72.39,101.6 76.2,101.6 76.2,119.38 68.58,119.38 68.58,116.84 67.31,116.84 67.31,113.03 63.5,113.03 P3_R11.2 | P3_IC1.14 P3_C1.2 | 60.96,124.46 60.96,132.08 73.66,132.08 73.66,119.38
P3_VINP
  Top 0.6: P3_IC2.12 55.88,101.6 P3_R16.2
P3_VOFF
  Bottom 0.7: P3_ROFFSET.1 38.1,76.2 38.1,87.63 39.37,87.63 39.37,88.9 40.64,88.9 P3_IC2.9
P3_VOFFD
  Bottom 0.7: P3_R14.2 41.91,81.28 41.91,90.17 43.18,90.17 43.18,96.52 P3_IC2.10 | P3_R15.1 41.91,86.36
P3_VP
  Bottom 0.7: 60.96,99.06 P3_POT1.3 | P3_R7.1 58.42,96.52 60.96,96.52 60.96,100.33 59.69,100.33 59.69,107.95 58.42,107.95 P3_IC1.8
P3_VPID  (via drill 0.9 pad 2)
  Top 0.6: v57.15,86.36 49.53,86.36 49.53,87.63 45.72,87.63 | P3_IC2.7 38.1,91.44 38.1,88.9 45.72,88.9 P3_R10.2
  Bottom 0.7: v57.15,86.36 66.04,86.36 P3_R17.1 | 66.04,88.9 86.36,88.9 P3_J_OUT.1
P3_VREF
  Bottom 0.7: P3_IC1.1 P3_IC1.2 53.34,121.92 53.34,110.49 54.61,110.49 54.61,105.41 53.34,105.41 P3_R1.1
P3_VREFD
  Bottom 0.7: P3_IC1.3 49.53,119.38 49.53,120.65 48.26,120.65 48.26,123.19 35.56,123.19 P3_R13.1 | P3_R12.1 40.64,123.19
P3_VSEN
  Bottom 0.7: P3_R3.1 10.16,96.52 P3_J_IN.1
P4_+VBOB
  Bottom 2: 162.56,17.78 P4_D1.2 | P4_J_VBOB.1 P4_J_COIL.1
P4_BASE
  Bottom 0.7: P4_Q1.1 P4_D2.2
P4_BASEA
  Bottom 0.7: P4_RBASE.2 P4_D2.1
P4_COILN
  Bottom 2: P4_J_COIL.2 175.26,27.94 P4_D1.1 170.18,33.02 170.18,43.18 P4_Q1.2
P4_INMU
  Top 0.6: P4_IC2.13 137.16,104.14 137.16,106.68 144.78,106.68 P4_C3.1
  Bottom 0.7: P4_R18.2 162.56,50.8 162.56,78.74 148.59,78.74 148.59,87.63 147.32,87.63 147.32,96.52 144.78,96.52 P4_C3.1
P4_IOUT
  Bottom 0.7: P4_IC2.14 139.7,106.68 P4_C3.2 137.16,104.14 137.16,97.79 138.43,97.79 138.43,96.52 142.24,96.52 P4_RBASE.1
P4_ISENSE
  Bottom 2: P4_Q1.3 160.02,40.64 P4_R18.1 P4_RS.15 P4_RS.10 | 111.76,41.91 152.4,41.91 | P4_RS.6 P4_RS.11 | P4_RS.7 P4_RS.12 | P4_RS.8 P4_RS.13 | P4_RS.9 P4_RS.14
P4_PGND
  Bottom 2: P4_JP_GND.2 157.48,66.04 157.48,68.58 106.68,68.58 106.68,15.24 160.02,15.24 160.02,10.16 167.64,10.16 P4_J_VBOB.2
P4_R6C2
  Bottom 0.7: P4_C2.1 111.76,120.65 123.19,120.65 123.19,118.11 124.46,118.11 P4_R6.2
P4_SUMN  (via drill 0.9 pad 2)
  Top 0.6: v124.46,83.82 v124.46,88.9
  Bottom 0.7: P4_R8.2 146.05,88.9 | 125.73,93.98 P4_IC2.6 | P4_R7.2 146.05,93.98 146.05,73.66 128.27,73.66 128.27,76.2 P4_ROFFSET.2 127,77.47 124.46,77.47 v124.46,83.82 | P4_R9.2 124.46,96.52 124.46,95.25 125.73,95.25 125.73,92.71 124.46,92.71 v124.46,88.9 | 137.16,73.66 137.16,87.63 138.43,87.63 138.43,88.9 139.7,88.9 P4_R10.1
P4_U1N
  Bottom 0.7: P4_IC1.6 143.51,111.76 143.51,110.49 139.7,110.49 139.7,107.95 140.97,107.95 140.97,105.41 142.24,105.41 142.24,100.33 139.7,100.33 P4_R1.2
P4_U1P  (via drill 0.9 pad 2)
  Top 0.6: v133.35,114.3 119.38,114.3 P4_R4.1
  Bottom 0.7: P4_R3.2 118.11,96.52 118.11,100.33 119.38,100.33 P4_R4.1 | v133.35,114.3 140.97,114.3 140.97,115.57 143.51,115.57 143.51,114.3 P4_IC1.5
P4_U2N  (via drill 0.9 pad 2)
  Top 0.6: v156.21,101.6 152.4,101.6 P4_POT1.1
  Bottom 0.7: v156.21,101.6 162.56,101.6 P4_R5.2 | P4_IC1.9 149.86,111.76 149.86,107.95 151.13,107.95 151.13,105.41 152.4,105.41 P4_POT1.1
P4_U3N
  Bottom 0.7: P4_IC1.13 158.75,121.92 158.75,123.19 165.1,123.19 | P4_C1.1 160.02,129.54 160.02,123.19 | P4_R11.1 157.48,121.92 | P4_POT2.2 P4_POT2.3
P4_U4N
  Bottom 0.7: P4_IC2.2 129.54,104.14 129.54,113.03 128.27,113.03 128.27,114.3 123.19,114.3 123.19,115.57 121.92,115.57 121.92,118.11 120.65,118.11 120.65,119.38 116.84,119.38 P4_POT3.1 P4_C2.2
P4_U5P
  Bottom 0.7: P4_RBIAS.1 119.38,91.44 119.38,99.06 123.19,99.06 123.19,97.79 125.73,97.79 125.73,96.52 P4_IC2.5
P4_VCAL
  Bottom 0.7: P4_R16.1 158.75,104.14 158.75,107.95 166.37,107.95 166.37,104.14 P4_POT4.2
P4_VD
  Bottom 0.7: 127,110.49 121.92,110.49 P4_POT3.2 | P4_R9.1 121.92,106.68 P4_IC2.1 P4_POT3.3
P4_VDIV
  Bottom 0.7: P4_R17.2 P4_POT4.1
P4_VE
  Top 0.6: P4_R2.2 142.24,116.84 142.24,109.22 P4_IC1.7 144.78,107.95 151.13,107.95 151.13,106.68 162.56,106.68 P4_R5.1
  Bottom 0.7: P4_R6.1 P4_R2.2 | P4_R5.1 162.56,115.57 165.1,115.57 P4_POT2.1
P4_VI
  Bottom 0.7: P4_R8.1 154.94,88.9 154.94,92.71 156.21,92.71 156.21,93.98 165.1,93.98 165.1,100.33 166.37,100.33 166.37,101.6 170.18,101.6 170.18,119.38 162.56,119.38 162.56,116.84 161.29,116.84 161.29,113.03 157.48,113.03 P4_R11.2 | P4_IC1.14 P4_C1.2 | 154.94,124.46 154.94,132.08 167.64,132.08 167.64,119.38
P4_VINP
  Top 0.6: P4_IC2.12 149.86,101.6 P4_R16.2
P4_VOFF
  Bottom 0.7: P4_ROFFSET.1 132.08,76.2 132.08,87.63 133.35,87.63 133.35,88.9 134.62,88.9 P4_IC2.9
P4_VOFFD
  Bottom 0.7: P4_R14.2 135.89,81.28 135.89,90.17 137.16,90.17 137.16,96.52 P4_IC2.10 | P4_R15.1 135.89,86.36
P4_VP
  Bottom 0.7: 154.94,99.06 P4_POT1.3 | P4_R7.1 152.4,96.52 154.94,96.52 154.94,100.33 153.67,100.33 153.67,107.95 152.4,107.95 P4_IC1.8
P4_VPID  (via drill 0.9 pad 2)
  Top 0.6: v151.13,86.36 143.51,86.36 143.51,87.63 139.7,87.63 | P4_IC2.7 132.08,91.44 132.08,88.9 139.7,88.9 P4_R10.2
  Bottom 0.7: v151.13,86.36 160.02,86.36 P4_R17.1 | 160.02,88.9 180.34,88.9 P4_J_OUT.1
P4_VREF
  Bottom 0.7: P4_IC1.1 P4_IC1.2 147.32,121.92 147.32,110.49 148.59,110.49 148.59,105.41 147.32,105.41 P4_R1.1
P4_VREFD
  Bottom 0.7: P4_IC1.3 143.51,119.38 143.51,120.65 142.24,120.65 142.24,123.19 129.54,123.19 P4_R13.1 | P4_R12.1 134.62,123.19
P4_VSEN
  Bottom 0.7: P4_R3.1 104.14,96.52 P4_J_IN.1

### Text on the board
tPlace: PID 1 | PID 2 | +16V | -16V | GND | +5V | +16V | -16V | GND | +5V | U3 | U6 | U3 | U6 | U1 | U2 | U1 | U2 | U4 | U8 | U4 | U8 | U5 | U7 | U5 | U7 | VSEN | VPID | VSEN | VPID | GND | GND | PGND | PGND | RS 10 x 1R/5W = 0.1R | RS 10 x 1R/5W = 0.1R | B | B | C | C | E | E | BOB+ | BOB- | BOB+ | BOB- | +VBOB | PGND | +VBOB | PGND | PID 3 | PID 4 | +16V | -16V | GND | +5V | +16V | -16V | GND | +5V | U3 | U6 | U3 | U6 | U1 | U2 | U1 | U2 | U4 | U8 | U4 | U8 | U5 | U7 | U5 | U7 | VSEN | VPID | VSEN | VPID | GND | GND | PGND | PGND | RS 10 x 1R/5W = 0.1R | RS 10 x 1R/5W = 0.1R | B | B | C | C | E | E | BOB+ | BOB- | BOB+ | BOB- | +VBOB | PGND | +VBOB | PGND